# EasyEDA Pro project ProPrj_油液微水_2026-11-05.epro

# Schematic Schematic1

## Sheets
1 P1: Board Name: Board1; Create Date: 2026-10-13; Page Name: P1; Project Name: 油液微水; Schematic Name: Schematic1; Update Date: 2026-10-13; Company: 嘉立创EDA; Page Size: A4; Version: V1.0
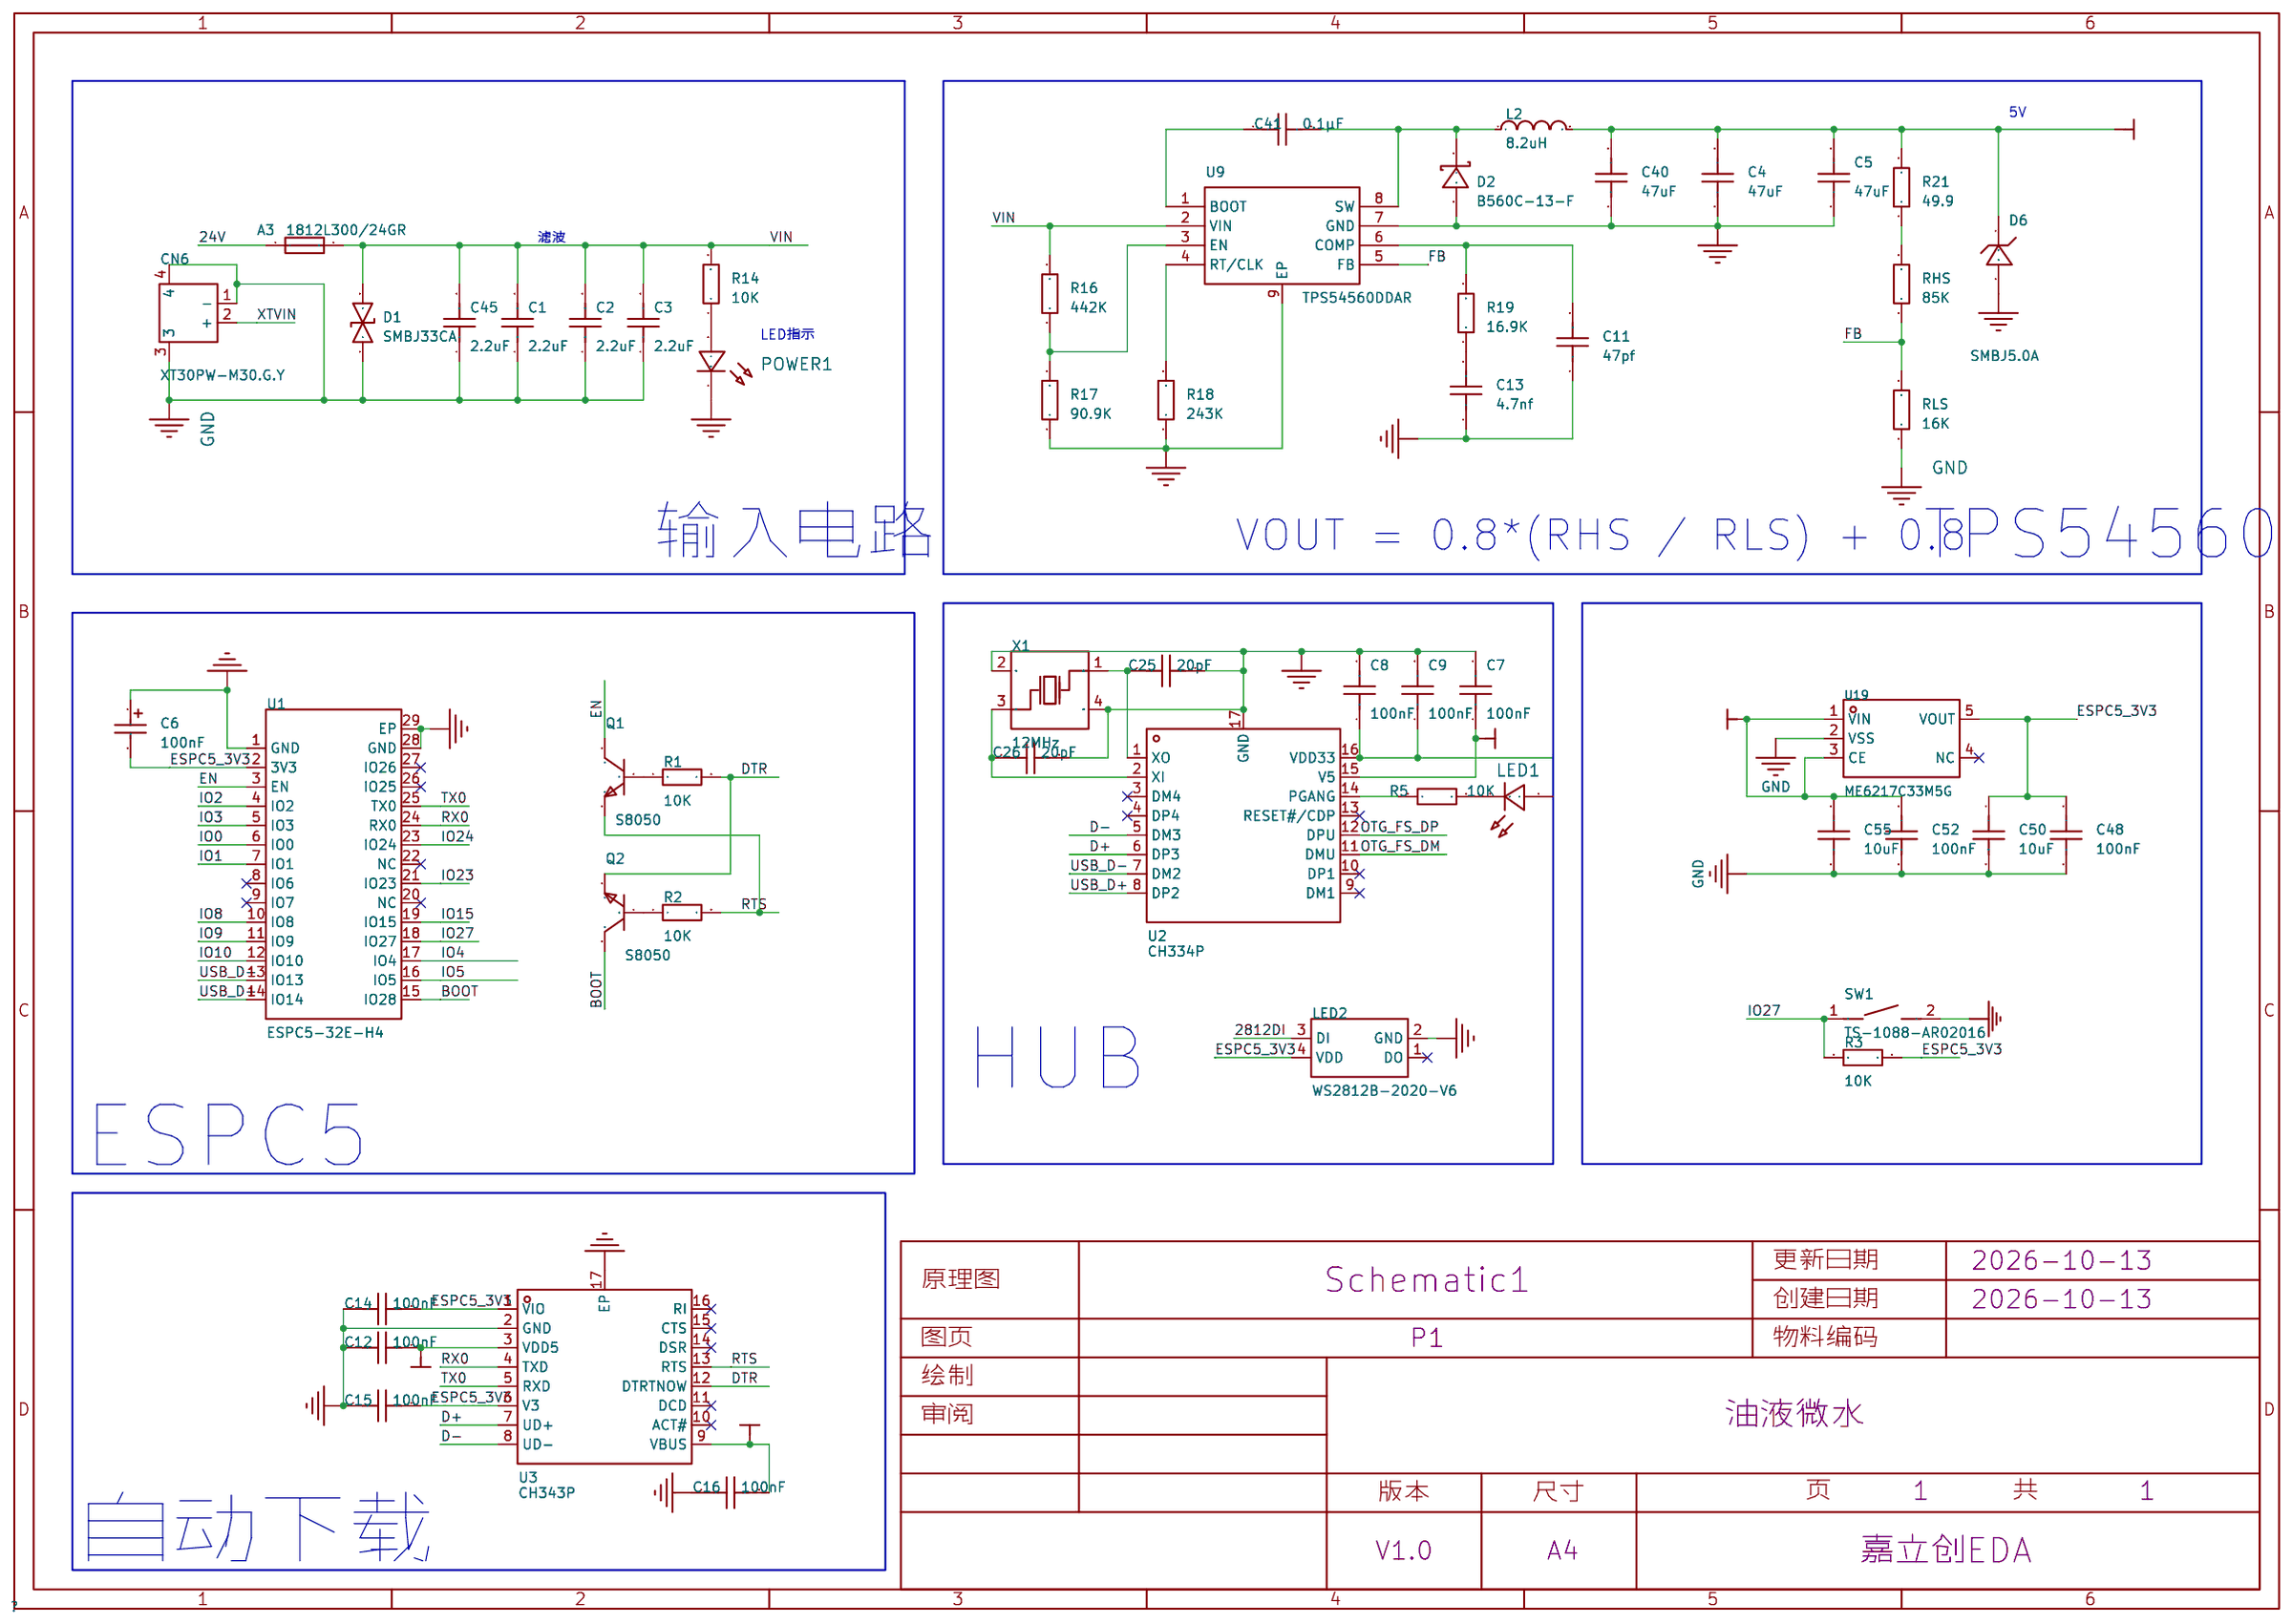
[diagram p0: P1]
2 P2: Page Name: P2
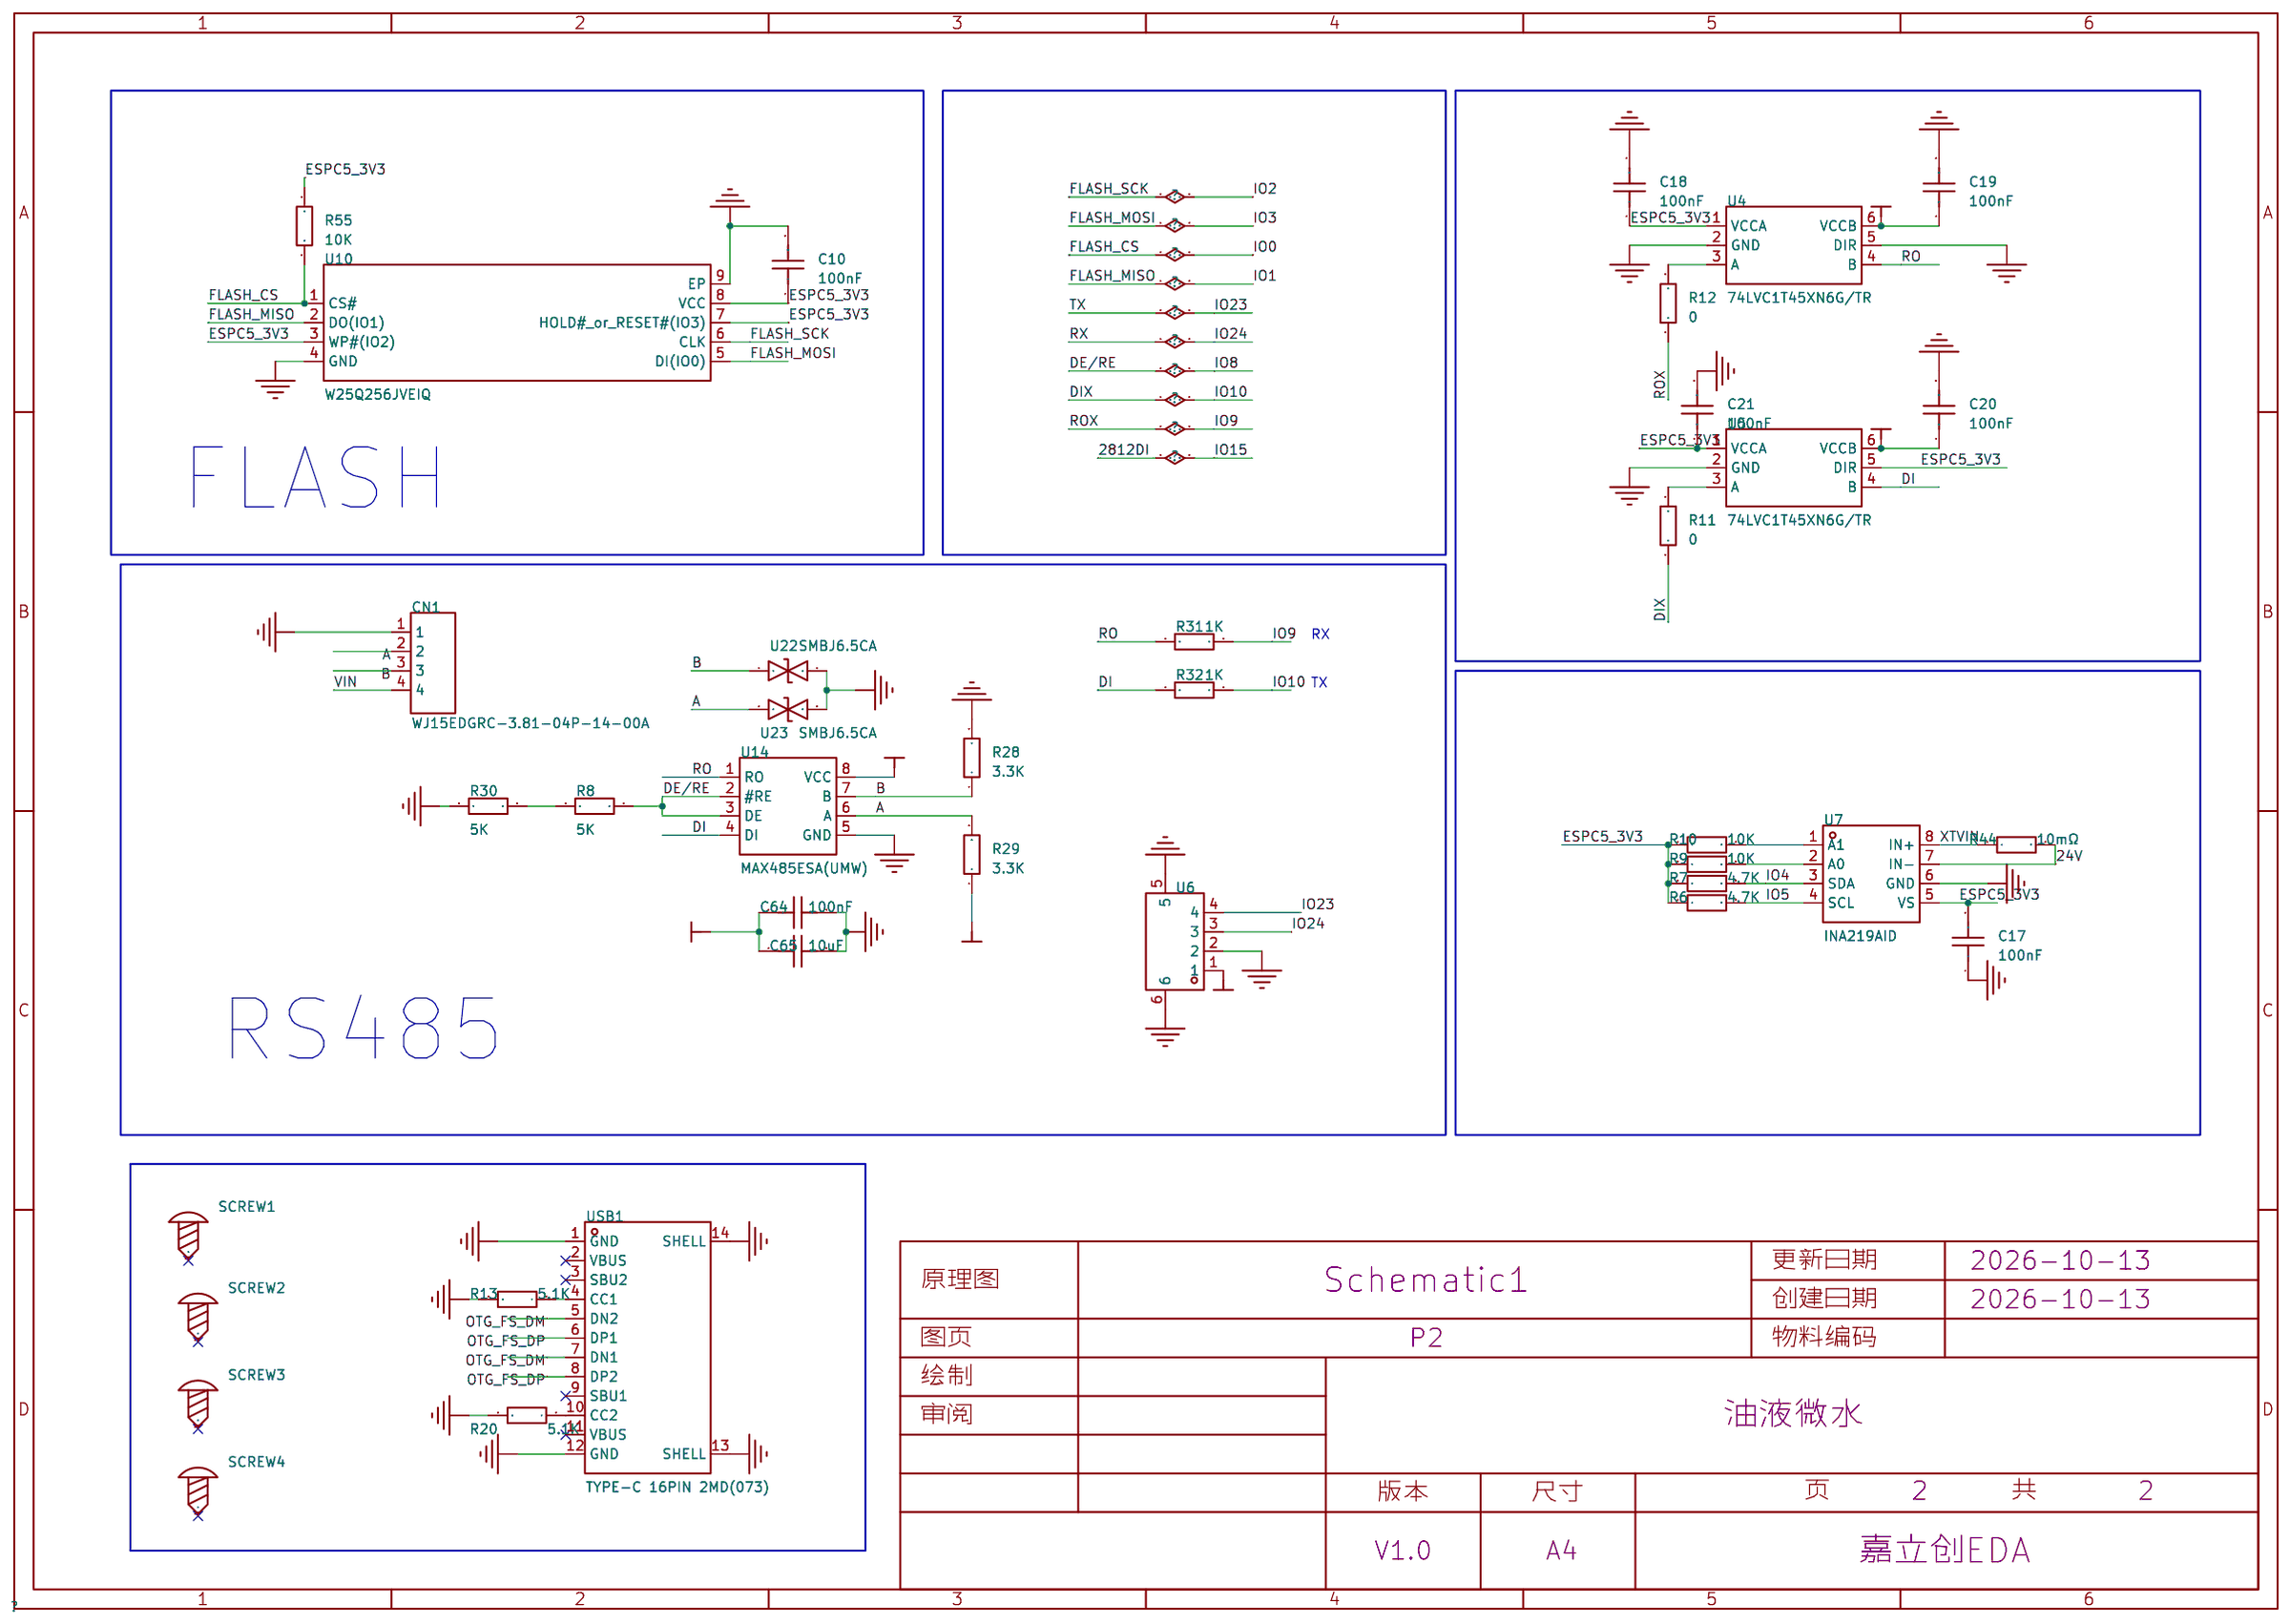
[diagram p1: P2]

## Parts
sheet P1
A3  1812L300/24GR  [F1812]
C1  2.2uF  [C1206]
C2  2.2uF  [C1206]
C3  2.2uF  [C1206]
C4  47uF  [C0805]
C5  47uF  [C0805]
C6  100nF  [CASE-A_3216]
C7  100nF  [C0603]
C8  100nF  [C0603]
C9  100nF  [C0603]
C11  47pf  [C0805]
C12  100nF  [C0603]
C13  4.7nf  [C0805]
C14  100nF  [C0603]
C15  100nF  [C0603]
C16  100nF  [C0603]
C25  20pF  [C0603]
C26  20pF  [C0603]
C40  47uF  [C0805]
C41  0.1µF  [C0805]
C45  2.2uF  [C1206]
C48  100nF  [C0603]
C50  10uF  [C0603]
C52  100nF  [C0603]
C55  10uF  [C0603]
CN6  XT30PW-M30.G.Y  [CONN-TH_XT30PW-M]
D1  SMBJ33CA  [SMB_L4.6-W3.6-LS5.3-BI]
D2  B560C-13-F  [SMC_L7.1-W6.2-LS8.1-RD]
D6  SMBJ5.0A  [SMB_L4.6-W3.6-LS5.3-RD]
L2  8.2uH  [IND-SMD_L11.5-W10.0_FXL1040]
LED1  -  [LED_0603]
LED2  WS2812B-2020-V6  [LED-SMD_4P-L2.2-W2.0-P1.00_WS2815C-2020-4P]
POWER1  -  [LED_0603]
Q1  S8050  [SOT-23-3_L2.9-W1.3-P1.90-LS2.4-BR]
Q2  S8050  [SOT-23-3_L2.9-W1.3-P1.90-LS2.4-BR]
R1  10K  [R0603]
R2  10K  [R0603]
R3  10K  [R0603]
R5  10K  [R0603]
R14  10K  [R0805]
R16  442K  [R0805]
R17  90.9K  [R0805]
R18  243K  [R0805]
R19  16.9K  [R0805]
R21  49.9  [R0805]
RHS  85K  [R0805]
RLS  16K  [R0805]
SW1  TS-1088-AR02016  [SW-SMD_L3.9-W3.0-P4.45]
U1  ESPC5-32E-H4  [WIFIM-SMD_28P-L19.2-W18.0-P1.27-TL_ESPC5-32E-H4]
U2  CH334P  [QFN-16_L3.0-W3.0-P0.50-BL-EP1.7]
U3  CH343P  [TQFN-16_L3.0-W3.0-P0.50-BL-EP1.7]
U9  TPS54560DDAR  [SOIC-8_L5.0-W4.0-P1.27-LS6.0-BL-EP2.0]
U19  ME6217C33M5G  [SOT-23-5_L3.0-W1.7-P0.95-LS2.8-BR]
X1  12MHz  [CRYSTAL-SMD_4P-L3.2-W2.5-BL]
sheet P2
C10  100nF  [C0603]
C17  100nF  [C0603]
C18  100nF  [C0603]
C19  100nF  [C0603]
C20  100nF  [C0603]
C21  100nF  [C0603]
C64  100nF  [C0603]
C65  10uF  [C0603]
CN1  WJ15EDGRC-3.81-04P-14-00A  [CONN-TH_WJ15EDGRC-3.81-4P]
R6  4.7K  [R0603]
R7  4.7K  [R0603]
R8  5K  [R0603]
R9  10K  [R0603]
R10  10K  [R0603]
R11  0  [R0603]
R12  0  [R0603]
R13  5.1K  [R0603]
R20  5.1K  [R0603]
R28  3.3K  [R0603]
R29  3.3K  [R0603]
R30  5K  [R0603]
R31  1K  [R0603]
R32  1K  [R0603]
R44  10mΩ  [R1206]
R55  10K  [R0603]
SCREW1  -  [M3螺丝]
SCREW2  -  [M3螺丝]
SCREW3  -  [M3螺丝]
SCREW4  -  [M3螺丝]
U4  74LVC1T45XN6G/TR  [SOT-23-6_L2.9-W1.6-P0.95-LS2.8-BR]
U5  74LVC1T45XN6G/TR  [SOT-23-6_L2.9-W1.6-P0.95-LS2.8-BR]
U6  WAFER-GH1.25-4PWB  [CONN-SMD_4P-P1.25_XUNPU_WAFER-GH1.25-4PWB]
U7  INA219AID  [SOIC-8_L4.9-W3.9-P1.27-LS6.0-BL]
U10  W25Q256JVEIQ  [WSON-8_L6.0-W8.0-P1.27-BL-EP]
U14  MAX485ESA(UMW)  [SOP-8_L5.0-W4.0-P1.27-LS6.0-BL]
U22  SMBJ6.5CA  [SMB_L4.6-W3.5-LS5.3-BI]
U23  SMBJ6.5CA  [SMB_L4.6-W3.5-LS5.3-BI]
USB1  TYPE-C 16PIN 2MD(073)  [USB-C-SMD_TYPE-C-6PIN-2MD-073_2]

## Library data of the parts
A3 = 1812L300/24GR: 最大电压:24V;最大电流:40A;保持电流:3A;跳闸电流:5A;; Supplier Part: C20627123; Manufacturer: LUTE(陆特); Supplier Footprint: 1812; Datasheet: https://atta.szlcsc.com/upload/public/pdf/source/20240229/289BC9D14A0E804C9E14D6209DA64A38.pdf; Supplier: LCSC; Operating Voltage (Max): 24V; Current Rating (Max): 40A; Hold Current: 3A; Trip Current: 5A; Power Dissipation: 1.4W; Resistance - Initial (Ri) (Min): 10mΩ; Resistance - Post Trip (R1) (Max): 60mΩ; Maximum Time to Trip: 4s; Operating Temperature: -40℃~+85℃
C1-C3 C45 = CAP_1206: Supplier Footprint: 1206
C4 C5 C11 C13 C40 C41 = CAP_0805: Supplier Footprint: 0805
C6 = TAJA104K035RNJ: 容值:100nF;精度:±10%;额定电压:35V;等效串联电阻:24Ω@100kHz;; LCSC Part Name: 100nF ±10% 35V; Supplier Part: C7173; Manufacturer: Kyocera AVX; Supplier Footprint: CASE-A-3216; JLCPCB Part Class: Extended Part; Datasheet: https://atta.szlcsc.com/upload/public/pdf/source/20160107/1457707750344.pdf; Supplier: LCSC; Tolerance: ±10%; Rated Voltage: 35V; Equivalent Series Resistance(ESR): 24Ω@100kHz; Operating Temperature: -55℃~+125℃
C7-C10 C12 C14-C21 C25 C26 C48 C50 C52 C55 C64 C65 = CAP_0603: Supplier Footprint: 0603
CN6 = XT30PW-M30.G.Y: LCSC Part Name: AMASS(艾迈斯)航模插头 卧式弯脚 XT30PW-M公头; Supplier Part: C431092; Manufacturer: AMASS(艾迈斯); JLCPCB Part Class: Extended Part; Datasheet: https://item.szlcsc.com/datasheet/XT30PW-M30.G.Y/426930.html; Supplier: LCSC; Type: 航模插头; RatedVoltage: DC 500V; InterfaceType: 公头; RatedCurrent: 15A; RecommendedWireGauge: 16/18/20AWG; contact resistance: 1.2mΩ; specifications: 2pin
D1 = SMBJ33CA: 反向截止电压(Vrwm):33V;最大钳位电压:53.3V;峰值脉冲电流(Ipp):11.3A;击穿电压:36.7V;; Supplier Part: C143164; Manufacturer: FMS(美丽微); Supplier Footprint: SMB(DO-214AA); JLCPCB Part Class: Extended Part; Datasheet: https://atta.szlcsc.com/upload/public/pdf/source/20191125/C461412_D06D094152DCAA63D23E11D143615915.pdf; Supplier: LCSC; Reverse Stand-Off Voltage (Vrwm): 33V; Maximum Clamping Voltage: 53.3V; Peak Pulse Current (Ipp): 11.3A; Breakdown Voltage: 36.7V; Type: TVS
D2 = B560C-13-F: LCSC Part Name: 电压:60V 电流:5A; Supplier Part: C85100; Manufacturer: DIODES(美台); Supplier Footprint: SMC(DO-214AB); Datasheet: https://atta.szlcsc.com/upload/public/pdf/source/20171023/C134461_15087453602301052556.pdf; Supplier: LCSC; Forward Voltage (Vf@If): 700mV@5A; Reverse Voltage (Vr): 60V; Rectified Current: 5A; Reverse Leakage Current (Ir): 500uA@60V
D6 = SMBJ5.0A_C83333: 极性:单向;反向截止电压(Vrwm):5V;钳位电压:9.2V;峰值脉冲电流(Ipp):65.3A;峰值脉冲功率(Ppp):600W;击穿电压:6.4V;; LCSC Part Name: 单向TVS 5V截止 峰值浪涌电流：65.3A; Supplier Part: C83333; Manufacturer: Littelfuse(美国力特); Supplier Footprint: DO-214AA; Datasheet: https://item.szlcsc.com/datasheet/SMBJ5.0A/84497.html; Supplier: LCSC; Polarity: 单向; Reverse Stand-Off Voltage (Vrwm): 5V; Clamping Voltage: 9.2V; Peak Pulse Current (Ipp): 65.3A; Peak Pulse Power Dissipation (Ppp): 600W; Voltage - Breakdown: 6.4V; Reverse Leakage Current (Ir): 65.3uA; Operating Temperature: -65℃~+150℃; level of protection: IEC 61000-4-4；IEC 61000-4-2; Type: TVS
L2 = MWSA1004S-8R2MT: 电感值:8.2uH;精度:±20%;额定电流:8A;饱和电流(Isat):9A;类型:-;; LCSC Part Name: 8.2uH ±20% 9A; Supplier Part: C408486; Manufacturer: Sunlord(顺络); Supplier Footprint: SMD,11x10mm; JLCPCB Part Class: Extended Part; Datasheet: https://item.szlcsc.com/datasheet/MWSA1004S-8R2MT/397838.html; Supplier: LCSC; Tolerance: ±20%; Current Rating: 8A; Current - Saturation(Isat): 9A; DC Resistance(DCR): 27mΩ
LED1 POWER1 = LED_0603-R: Supplier Footprint: 0603
LED2 = WS2812B-2020-V6: LCSC Part Name: 智能外控集成LED光源，内置信号整形和复位电路，支持单线通讯，颜色一致性好; Supplier Part: C52917434; Manufacturer: worldsemi; Supplier Footprint: SMD2020-4P; JLCPCB Part Class: Extended Part; Datasheet: https://item.szlcsc.com/datasheet/WS2812B-2020-V6/55827425.html; Supplier: LCSC; Dominant Wavelength - R: 620nm~625nm; Dominant Wavelength - G: 515nm~520nm; Dominant Wavelength - B: 465nm~470nm; Data Transmission Rate: 800Kbit/s; Voltage - Supply: 3.3V~5.3V; Quiescent Current: 1uA; Operating Temperature: -40℃~+85℃; Fixed-Frequency Pwm Mode: 2kHz; Length: 2mm; Width: 2mm; Height: 0.84mm; Features: 内置上电复位电路；集成智能反向连接保护功能；内置掉电复位电路; Luminous Intensity - R: 200mcd; Luminous Intensity - G: 520mcd; Luminous Intensity - B: 160mcd; Transmission Delay: 300ns; Fall Time: 120us
Q1 Q2 = S8050_C2688231: 晶体管类型:NPN;集电极电流(Ic):800mA;集射极击穿电压(Vceo):25V;功率(Pd):350mW;直流电流增益(hFE@Ic,Vce):200@50mA,1V;; LCSC Part Name: NPN 电流:800mA 耐压:25V; Supplier Part: C2688231; Manufacturer: WPMtek(维攀); Supplier Footprint: SOT-23; JLCPCB Part Class: 扩展库; Datasheet: https://atta.szlcsc.com/upload/public/pdf/source/20210222/C2688231_A300D69B63960DEEA81943DA6762DFE1.pdf; Supplier: LCSC; Transistor Type: NPN; Collector Current (Ic): 800mA; Collector-Emitter Breakdown Voltage (Vceo): 25V; Power Dissipation (Pd): 350mW; DC Current Gain (hFE@Ic,Vce): 200@50mA,1V; Transition Frequency (fT): 150MHz; Collector Cut-Off Current (Icbo): 100nA; Collector-Emitter Saturation Voltage (VCE(sat)@Ic,Ib): 600mV@500mA,50mA
R1-R3 R5-R13 R20 R28-R32 R55 = Res_0603: Supplier Footprint: 0603
R14 R16-R19 R21 RHS RLS = Res_0805: Supplier Footprint: 0805
SW1 = TS-1088-AR02016: 电路结构:单刀单掷;按钮形状:圆形按钮;作用力:1.6N;安装方式:立贴;开关长度:3.9mm;开关宽度:3mm;开关高度:2mm;带支架:不带支架;触点电流:50mA;额定电压:12V;带灯:-;工作寿命:10万次;; LCSC Part Name: 3.9*3*2mm 立贴 轻触开关; Supplier Part: C720477; Manufacturer: XUNPU(讯普); Supplier Footprint: SMD,4x3mm; JLCPCB Part Class: Basic Part; Datasheet: https://item.szlcsc.com/datasheet/TS-1088-AR02016/763484.html; Supplier: LCSC; Circuit: 单刀单掷; Actuator Style: 圆形按钮; Operating Force: 1.6N; Mounting Type: 立贴; Length: 3.9mm; Width: 3mm; Switch Height: 2mm; with Bracket: 不带支架; Contact Current: 50mA; Voltage Rating: 12V; Actuator/Cap Color: 黑色; Termination Style: SMD接片; Life: 10万次; Operating Temperature: -30℃~+80℃
U1 = ESPC5-32E-H4: WiFi6 2.4&5G Zigbee3+Thread模组,ESP32-C5芯片,32Mbit Flash,IPEX接口模组; LCSC Part Name: ESP32-C5系列，WiFi 2.4G&5G 双频模组，ESPC5-32E-H4，蓝牙模组，ZigBee模组; Supplier Part: C52139915; Manufacturer: DOIT(四博智联); Supplier Footprint: SMD,19.2x18mm; JLCPCB Part Class: Extended Part; Datasheet: https://item.szlcsc.com/datasheet/ESPC5-32E-H4/54934547.html; Supplier: LCSC; Features: 集成蓝牙功能；集成Zigbee功能
U2 = CH334P: CH334和CH335是符合USB2.0协议规范的4端口USBHUB控制器芯片，上行端口支持USB2.0高速和全速，下行端口支持USB2.0高速480Mbps、全速12Mbps和低速1.5Mbps。; LCSC Part Name: 4端口USB HUB控制器芯片，支持USB2.0协议，多模式工作; Supplier Part: C5373042; Manufacturer: WCH(南京沁恒); Supplier Footprint: QFN-16(3x3); JLCPCB Part Class: Extended Part; Datasheet: https://item.szlcsc.com/datasheet/CH334P/6226077.html; Supplier: LCSC; type: 集线器; USB Protocol: USB 2.0; Data Rate: 480Mbps; Voltage - Supply: 3.3V; Operating Temperature: -40℃~+85℃; Memory Interface: I2C; Current - Supply: 85mA; Quiescent Supply Current: 0.4mA; Number of Channels: 4; Features: 端口状态监测；内部稳压器；端口电源开关控制；ESD保护；低功耗模式；上电复位
U3 = CH343P: 应用功能:USB转UART;USB协议版本:USB 2.0;通道数:-;数据速率:6Mbps;; LCSC Part Name: USB转高速串口芯片; Supplier Part: C2846043; Manufacturer: WCH(南京沁恒); Supplier Footprint: TQFN-16-EP(3x3); JLCPCB Part Class: Extended Part; Datasheet: https://item.szlcsc.com/datasheet/CH343P/3039795.html; Supplier: LCSC; Applications Function: USB转UART; USB Protocol: USB 2.0; Voltage - Supply: 3.3V；5V; Data Rate: 6Mbps; Operating Temperature: -40℃~+85℃; Current - Supply: 3mA; Quiescent Supply Current: 90uA; Features: 可编程波特率；唤醒功能；内置时钟发生器；硬件流控支持；低功耗模式；上电复位
U9 = TPS54560DDAR: LCSC Part Name: 4.5V至60V输入,5A降压DC-DC转换器; Supplier Part: C31966; Manufacturer: TI(德州仪器); Supplier Footprint: SOIC-8-EP; Datasheet: https://www.ti.com/cn/lit/gpn/tps54560; Supplier: LCSC; Function: 降压型; Output Type: 可调; Input Voltage: 4.5V~60V; Output Voltage: 800mV~58.8V; Output Current: 5A; Switching Frequency: 2.5MHz; Operating Temperature: -40℃~+150℃@(TJ); Synchronous Rectification: 否; Number of Outputs: 1; Topology: 降压式; Switch tube (built-in/external): 内置
U19 = ME6217C33M5G: 输出类型:固定;输出极性:正;最大输入电压:7V;输出电压:3.3V;输出电流:800mA;电源纹波抑制比(PSRR):65dB@(1kHz);; Supplier Part: C427602; Manufacturer: MICRONE(南京微盟); Supplier Footprint: SOT-23-5; JLCPCB Part Class: 扩展库; Datasheet: https://atta.szlcsc.com/upload/public/pdf/source/20190910/C427602_D4B9162A2E9D9EF57C60010DFDECEF37.pdf; Supplier: LCSC; Output Type: 固定; Output Polarity: 正; Number of Outputs: 1; Maximum Input Voltage: 7V; Output Voltage: 3.3V; Dropout Voltage: 180mV@(300mA); Output Current: 800mA; Power Supply Rejection Ratio (PSRR): 65dB@(1kHz)
X1 = X322512MSB4SI: 晶振类型:贴片晶振;频率:12MHz;常温频差:±10ppm;负载电容:20pF;频率稳定度:±20ppm;; LCSC Part Name: YSX321SL 12MHZ 4P 3225 20PF ±10PPM -40~85℃ (±20PPM); Supplier Part: C9002; Manufacturer: YXC(扬兴晶振); Supplier Footprint: SMD3225-4P; JLCPCB Part Class: Basic Part; Datasheet: https://item.szlcsc.com/datasheet/X322512MSB4SI/9522.html; Supplier: LCSC; Type: 贴片晶振; Normal temperature Frequency Tolerance: ±10ppm; Load Capacitance: 20pF; Frequency Stability: ±20ppm; Equivalent Series Resistance(ESR): 80Ω; Operating Temperature: -40℃~+85℃
CN1 = WJ15EDGRC-3.81-04P-14-00A: 连接器类型:板端/插座-闭口;固定方式:无固定装置;结构:1x4P;间距:3.81mm;颜色:绿色;安装方式:弯插;排数:1;每排PIN数:4;额定电流:8A;额定电压:300V;线规 - AWG:-;线规 - 平方毫米:-;工作温度:-40℃~+105℃;; LCSC Part Name: 无固定装置 1x4P 3.81mm 排数:1 每排P数:4; Supplier Part: C7245; Manufacturer: KANGNEX(康奈克斯电气); Supplier Footprint: 弯插,P=3.81mm; JLCPCB Part Class: Extended Part; Datasheet: https://item.szlcsc.com/datasheet/WJ15EDGRC-3.81-04P-14-00A/7720.html; Supplier: LCSC; Connector Type: 板端/插座-闭口; Termination Style: 无固定装置; Number of Positions or Pins: 1x4P; Pitch: 3.81mm; Color: 绿色; Mounting Type: 弯插; Number of Pins: 4P; Number of Rows: 1; Number of PINs Per Row: 4; Current Rating: 8A; Voltage Rating (Max): 300V; Operating Temperature: -40℃~+105℃
R44 = RLM12FTCMR010: 电阻类型:采样电阻;阻值:10mΩ;精度:±1%;功率:1W;温度系数:±100ppm/℃;安装方式:贴片;; LCSC Part Name: 10mΩ ±1% 1W 合金电阻; Supplier Part: C188070; Manufacturer: 大毅科技; Supplier Footprint: 1206; JLCPCB Part Class: Extended Part; Datasheet: https://item.szlcsc.com/datasheet/RLM12FTCMR010/199476.html; Supplier: LCSC; Type: 采样电阻; Tolerance: ±1%; Power(Watts): 1W; Temperature Coefficient: ±100ppm/℃; Mounting Type: 贴片
SCREW1-SCREW4 = M3螺丝: Supplier Footprint: 插件
U4 U5 = 74LVC1T45XN6G/TR: 输入类型:-;工作电压:1.65V~5.5V;元件数:1;每个元件位数:1;灌电流(IOL):32mA;拉电流(IOH):32mA;; Supplier Part: C5153337; Manufacturer: SGMICRO(圣邦微); Supplier Footprint: SOT-23-6; JLCPCB Part Class: Extended Part; Datasheet: https://item.szlcsc.com/datasheet/74LVC1T45XN6G%252FTR/5780065.html; Supplier: LCSC; output type: 三态; Voltage - Supply: 1.65V~5.5V; Number of Elements: 1; Number of Bits per Element: 1; Channel Type: 双向; Current - Output Low(IOL): 32mA; Current - Output High(IOH): 32mA; Logic Family: 74LVC; Operating Temperature: -40℃~+125℃; Quiescent Current: 2uA; Propagation Delay: 2.5ns@5V,15pF; Features: 掉电隔离；电平转换
U6 = WAFER-GH1.25-4PWB: 插针结构:1x4P;间距:1.25mm;安装方式:卧贴;参考系列:GH;总PIN数:4P;排数:1;每排PIN数:4;行距:-;额定电流:1A;触头材质:黄铜;触头镀层:-;工作温度范围:-25℃~+85℃;; LCSC Part Name: 1x4P 间距:1.25mm 卧贴 系列:GH; Supplier Part: C3029379; Manufacturer: XUNPU(讯普); Supplier Footprint: SMD,P=1.25mm,卧贴; JLCPCB Part Class: Extended Part; Datasheet: https://atta.szlcsc.com/upload/public/pdf/source/20220527/CB8773BFB0913C3B8ABD62CB38BA101A.pdf; Supplier: LCSC; Pins Structure: 1x4P; Pitch: 1.25mm; Mounting Type: 卧贴; Reference Series: GH; Number of Pins: 4P; Number of Rows: 1; Number of PINs Per Row: 4; Current Rating: 1A; Contact Material: 黄铜; Operating Temperature: -25℃~+85℃; Voltage Rating: 125V; Plastic Material: LCP; Supplementary Features: 辅助焊脚; Color: 米色; Z-Height of the Board: 4.35mm; X-Length of Bottom Edge on Board (Spacing Line): 8.25mm; Y-Width of Bottom Edge on Board: 5mm
U7 = INA219AID: 放大器数:1;共模电压:300mV~26V;增益:-;带宽(-3db):-;; LCSC Part Name: 具有I2C接口的零漂移双向电流/功率监测计 停产; Supplier Part: C1574856; Manufacturer: TI(德州仪器); Supplier Footprint: SOIC-8; JLCPCB Part Class: Extended Part; Datasheet: https://www.ti.com/cn/lit/ds/symlink/ina219.pdf; Supplier: LCSC; Number of Channels: 1; Vcm - Common Mode Voltage: 300mV~26V; Ib - Input Bias Current: 20uA; Vos - Input Offset Voltage: 10uV; Operating Temperature: -40℃~+125℃; Differential Voltage: ±26V; Single Supply: 3V~5.5V; Quiescent Current: 700uA; Input Offset Voltage Drift(Vos TC): 0.1uV/℃; Common Mode Rejection Ratio (CMRR): 120dB; Features: 双向检测；输入滤波器；数字输出接口；功率监控；零漂移/自动稳零
U10 = W25Q256JVEIQ: 接口类型:SPI;存储容量:256Mbit;时钟频率(fc):133MHz;; LCSC Part Name: 具备双/四SPI接口的3V、256Mbit 串行闪存; Supplier Part: C2682312; Manufacturer: Winbond(华邦); Supplier Footprint: WSON-8-EP(6x8); JLCPCB Part Class: Extended Part; Datasheet: https://item.szlcsc.com/datasheet/W25Q256JVEIQ/2776751.html; Supplier: LCSC; Interface: SPI; Memory Size: 256Mbit; Clock Frequency: 133MHz; Voltage - Supply: 2.7V~3.6V; Standby Supply Current: 10uA; Program / Erase Cycles: 100000次; Page Programming Time (Tpp): 700us; Block Erase Time(tBE): 100ms@(64KB); Data Retention - TDR (Year): 20年; Operating Temperature: -40℃~+85℃; Features: 硬件写保护；绝对写保护；写使能锁存；软件写保护；上电复位；电源锁定保护
U14 = MAX485ESA(UMW): 类型:收发器;数据速率:2.5Mbps;; LCSC Part Name: 低功耗、压摆率受限的RS-485/RS-422收发器; Supplier Part: C668206; Manufacturer: UMW(友台半导体); Supplier Footprint: SOP-8; JLCPCB Part Class: Extended Part; Datasheet: https://item.szlcsc.com/datasheet/MAX485ESA(UMW)/698054.html; Supplier: LCSC; Type: 收发器; Number of Drivers: 1; Number of Receivers: 1; Voltage - Supply: 5V; Data Rate: 2.5Mbps; Number of Nodes: 32; Supply Current (Iq): 300uA; Communication Mode: 半双工
U22 U23 = SMBJ6.5CA_C7420377: 极性:双向;反向截止电压(Vrwm):6.5V;钳位电压:11.2V;峰值脉冲电流(Ipp):53.57A;峰值脉冲功率(Ppp):600W;击穿电压:7.22V;; LCSC Part Name: 双向TVS 6.5V截止 峰值浪涌电流：53.57A; Supplier Part: C7420377; Manufacturer: R+O(宏嘉诚); Supplier Footprint: DO-214AA(SMB); JLCPCB Part Class: Basic Part; Datasheet: https://item.szlcsc.com/datasheet/SMBJ6.5CA/8397199.html; Supplier: LCSC; Polarity: 双向; Reverse Stand-Off Voltage (Vrwm): 6.5V; Clamping Voltage: 11.2V; Peak Pulse Current (Ipp): 53.57A; Peak Pulse Power Dissipation (Ppp): 600W; Voltage - Breakdown: 7.22V; Reverse Leakage Current (Ir): 500uA; Number of Channels: 单路; Operating Temperature: -55℃~+150℃; level of protection: IEC 61000-4-2; Type: TVS
USB1 = TYPE-C 16PIN 2MD(073)_2: LCSC Part Name: Type-C 母 卧贴; Supplier Part: C2765186; Manufacturer: SHOU HAN(首韩); Supplier Footprint: SMD; JLCPCB Part Class: 扩展库; Datasheet: https://atta.szlcsc.com/upload/public/pdf/source/20211123/39B17C16241EAC15C5E277BDA434118E.pdf; Supplier: LCSC; Connector Type: Type-C; Gender: 母; Number of Ports: 1; Number of Contacts: 16P; Mounting Style: 卧贴; Current Rating - Power (Max): 5A; Operating Temperature Range: -25℃~+85℃

## Nets
24V: A3.1 R44.2 U7.7(IN-)
+5V: C4.2 C5.2 C7.1 C12.2 C16.2 C19.1 C20.1 C40.2 C52.1 C55.1 C64.1 C65.1 D6.1 L2.2 R21.2 R29.1 U2.15(V5) U3.3(VDD5) U3.9(VBUS) U4.6(VCCB) U5.6(VCCB) U6.1 U14.8(VCC) U19.1(VIN) U19.3(CE)
GND: C1.1 C2.1 C3.1 C4.1 C5.1 C6.1 C7.2 C8.2 C9.2 C10.2 C11.1 C12.1 C13.1 C14.1 C15.1 C16.1 C17.1 C18.2 C19.2 C20.2 C21.2 C25.2 C26.2 C40.1 C45.1 C48.2 C50.2 C52.2 C55.2 C64.2 C65.2 CN1.1 CN6.1(-) CN6.3 CN6.4 D1.1 D2.2(A) D6.2 LED2.2(GND) POWER1.1(C) R13.2 R17.1 R18.1 R20.2 R28.2 R30.2 RLS.1 SW1.2 U1.1(GND) U1.28(GND) U1.29(EP) U2.17(GND) U3.2(GND) U3.17(EP) U4.2(GND) U4.5(DIR) U5.2(GND) U6.2 U6.5 U6.6 U7.6(GND) U9.7(GND) U9.9(EP) U10.4(GND) U10.9(EP) U14.5(GND) U19.2(VSS) U22.2 U23.2 USB1.1(GND) USB1.12(GND) USB1.13(SHELL) USB1.14(SHELL) X1.2(GND) X1.4(GND)
VIN: A3.2 C1.2 C2.2 C3.2 C45.2 CN1.4 D1.2 R14.2 R16.2 U9.2(VIN)
2812DI: LED2.3(DI) U1.19(IO15)
A: CN1.2 R29.2 U14.6(A) U23.1
B: CN1.3 R28.1 U14.7(B) U22.1
BOOT: Q2.3(C) U1.15(IO28)
D+: U2.6(DP3) U3.7(UD+)
D-: U2.5(DM3) U3.8(UD-)
DE/RE: R8.1 U1.10(IO8) U14.2(#RE) U14.3(DE)
DI: R32.1 U5.4(B) U14.4(DI)
DIX: R11.1 R32.2 U1.12(IO10)
DTR: Q2.2(E) R1.2 U3.12(DTRTNOW)
EN: Q1.3(C) U1.3(EN)
ESPC5_3V3: C6.2 C10.1 C14.2 C15.2 C17.2 C18.1 C21.1 C48.1 C50.1 LED2.4(VDD) R3.2 R6.1 R7.1 R9.1 R10.1 R55.2 U1.2(3V3) U3.1(VIO) U3.6(V3) U4.1(VCCA) U5.1(VCCA) U5.5(DIR) U7.5(VS) U10.3(WP#(IO2)) U10.7(HOLD# or RESET#(IO3)) U10.8(VCC) U19.5(VOUT)
FB: RHS.1 RLS.2 U9.5(FB)
FLASH_CS: R55.1 U1.6(IO0) U10.1(CS#)
FLASH_MISO: U1.7(IO1) U10.2(DO(IO1))
FLASH_MOSI: U1.5(IO3) U10.5(DI(IO0))
FLASH_SCK: U1.4(IO2) U10.6(CLK)
IO4: R7.2 U1.17(IO4) U7.3(SDA)
IO5: R6.2 U1.16(IO5) U7.4(SCL)
IO9: R12.1 R31.2 U1.11(IO9)
IO23: U1.21(IO23) U6.4
IO24: U1.23(IO24) U6.3
IO27: R3.1 SW1.1 U1.18(IO27)
OTG_FS_DM: U2.11(DMU) USB1.5(DN2) USB1.7(DN1)
OTG_FS_DP: U2.12(DPU) USB1.6(DP1) USB1.8(DP2)
RO: R31.1 U4.4(B) U14.1(RO)
RTS: Q1.2(E) R2.2 U3.13(RTS)
RX0: U1.24(RX0) U3.4(TXD)
TX0: U1.25(TX0) U3.5(RXD)
USB_D+: U1.14(IO14) U2.8(DP2)
USB_D-: U1.13(IO13) U2.7(DM2)
XTVIN: CN6.2(+) R44.1 U7.8(IN+)
$1N2: R16.1 R17.2 U9.3(EN)
$1N4: R18.2 U9.4(RT/CLK)
$1N11: C11.2 R19.2 U9.6(COMP)
$1N12: C41.2 D2.1(K) L2.1 U9.8(SW)
$1N13: C13.2 R19.1
$1N17: C41.1 U9.1(BOOT)
$1N21: POWER1.2(A) R14.1
$1N24: R21.1 RHS.2
$1N35: Q1.1(B) R1.1
$1N36: Q2.1(B) R2.1
$1N60: C26.1 U2.2(XI) X1.3(OSC2)
$1N61: C25.1 U2.1(XO) X1.1(OSC1)
$1N64: C8.1 C9.1 LED1.2(A) U2.16(VDD33)
$1N65: LED1.1(C) R5.2
$1N66: R5.1 U2.14(PGANG)
$2N19: R8.2 R30.1
$2N64: R11.2 U5.3(A)
$2N65: R12.2 U4.3(A)
$2N83: R20.1 USB1.10(CC2)
$2N90: R13.1 USB1.4(CC1)
$2N111: R9.2 U7.2(A0)
$2N112: R10.2 U7.1(A1)

Not connected (* = marked no-connect by the designer): LED2 1(DO)*; SCREW1 1*; SCREW2 1*; SCREW3 1*; SCREW4 1*; U1 8(IO6)* 9(IO7)* 20(NC)* 22(NC)* 26(IO25)* 27(IO26)*; U2 3(DM4)* 4(DP4)* 9(DM1)* 10(DP1)* 13(RESET#/CDP)*; U3 10(ACT#)* 11(DCD)* 14(DSR)* 15(CTS)* 16(RI)*; U19 4(NC)*; USB1 2(VBUS)* 3(SBU2)* 9(SBU1)* 11(VBUS)*

## Notes on the sheets
sheet 1
- 5V
- 滤波
- LED指示
- 输入电路
- VOUT = 0.8*(RHS / RLS) + 0.8
- TPS54560
- HUB
- ESPC5
- 自动下载
sheet 2
- FLASH
- RX
- TX
- RS485

# Board PCB1
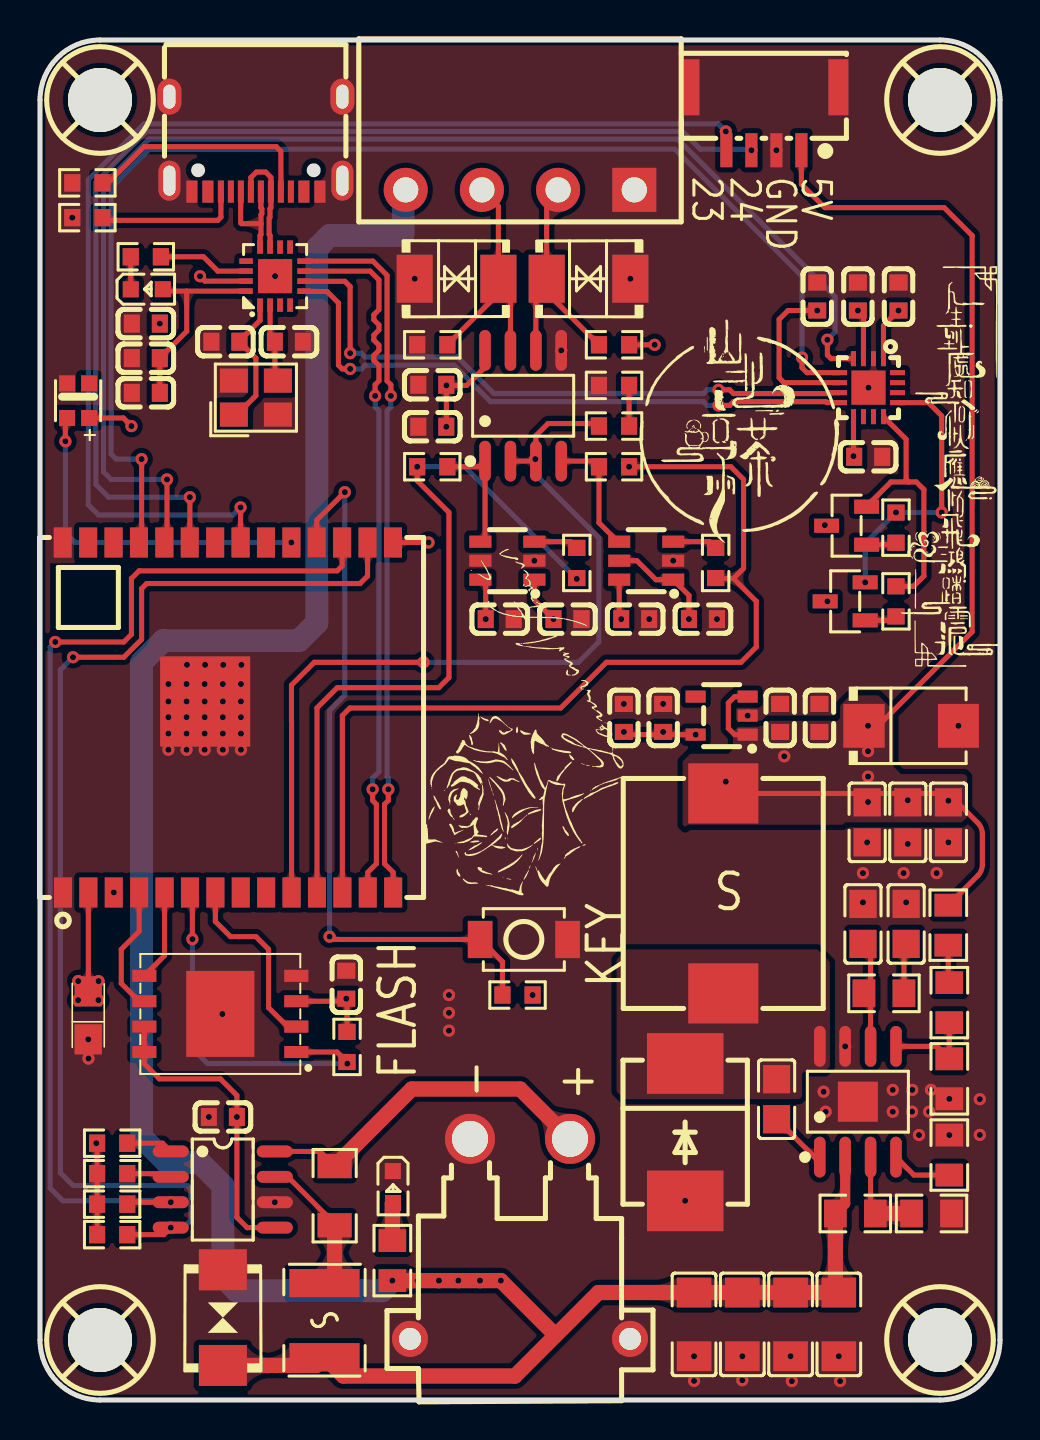
[diagram p2: board, top side]
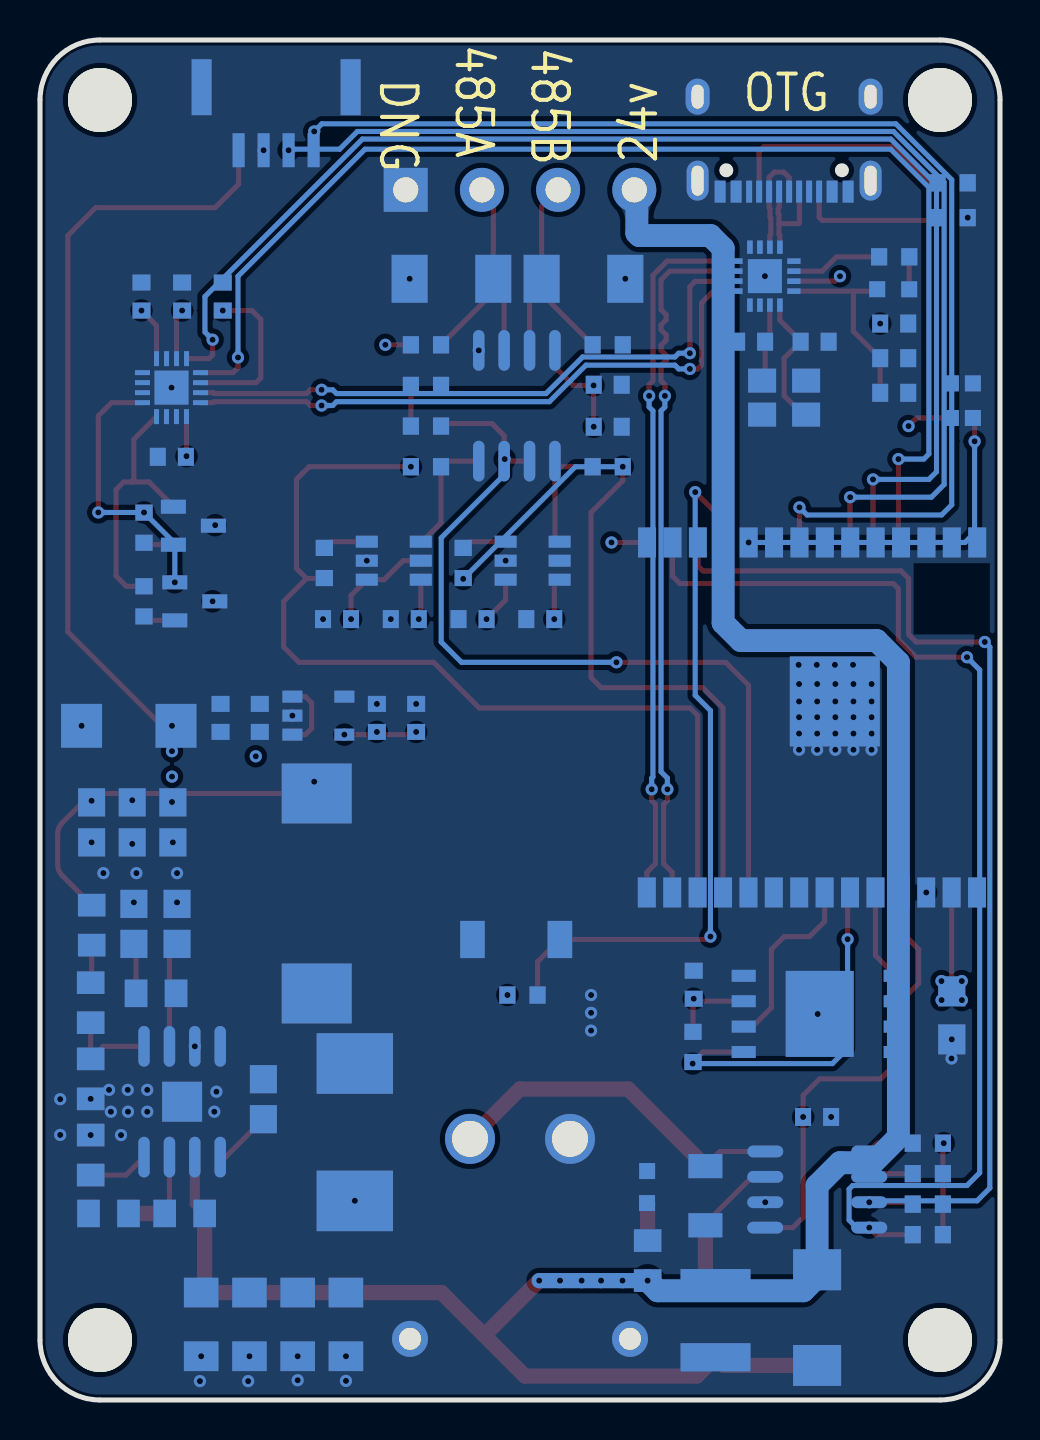
[diagram p3: board, bottom side, seen from below]

Outline 48 x 68 mm; copper layers: Top Layer, Inner1, Inner2, Bottom Layer. Coordinates in mm from the lower left corner of the outline.
Outline path: 0,65 0,3 arc(0.88,0.88) 3,0 45,0 arc(47.12,0.88) 48,3 48,65 arc(47.12,67.12) 45,68 3,68 arc(0.88,67.12) 0,65
Stack: Top Layer 0.035mm Outer layer thickness 1oz / Dielectric1 0.2104mm 7628 RC49% 8.6mil / Inner1 0.0152mm Inner layer thickness / Dielectric2 1.065mm 1.1mm H/HOZ Copper / Inner2 0.0152mm Inner layer thickness / Dielectric3 0.2104mm 7628 RC49% 8.6mil / Bottom Layer 0.035mm Outer layer thickness 1oz

## Design rules (mm)
net A: DP1
net B: DP1
net USB_D-: DP4
net USB_D+: DP4
net D-: DP5
net D+: DP5
net OTG_FS_DM: DP2
net OTG_FS_DP: DP2
spacing copperThickness1oz (default): track to track 0.102, other pairs 0.152 to 0.3
spacing copperThickness2oz: track to track 0.203, other pairs 0.152 to 0.3
track width copperThickness1oz (default): min 0.127, default 0.254, max 2.54
track width copperThickness2oz: min 0.203, default 0.254, max 2.54
differential pair differentialPair (default): width min 0.127, default 0.254, max 2.54; gap min 0.152, default 0.152
net $1N12 uses copperRegion
net GND uses copperRegion
net +5V uses copperRegion
net ESPC5_3V3 uses copperRegion

## Placement (name value [footprint] x y rotation side)
A3  1812L300/24GR  [F1812]  14.22 3.99 270 top
C1  2.2uF  [C1206]  37.53 3.78 90 top
C2  2.2uF  [C1206]  35.12 3.78 90 top
C3  2.2uF  [C1206]  32.7 3.78 90 top
C4  47uF  [C0805]  43.39 28.88 90 top
C5  47uF  [C0805]  45.42 28.88 90 top
C6  100nF  [CASE-A_3216]  2.41 19.23 90 top
C7  100nF  [C0603]  5.29 53.82 180 top
C8  100nF  [C0603]  5.29 52.09 180 top
C9  100nF  [C0603]  5.29 50.36 180 top
C10  100nF  [C0603]  15.31 20.76 90 top
C11  47pf  [C0805]  41.15 23.8 270 top
C12  100nF  [C0603]  40.89 55.17 270 top
C13  4.7nf  [C0805]  43.31 23.8 270 top
C14  100nF  [C0603]  38.86 55.17 270 top
C15  100nF  [C0603]  42.93 55.17 270 top
C16  100nF  [C0603]  41.41 47.16 180 top
C17  100nF  [C0603]  9.14 14.15 0 top
C18  100nF  [C0603]  26.37 39.04 0 top
C19  100nF  [C0603]  22.99 39.04 0 top
C20  100nF  [C0603]  29.76 39.04 0 top
C21  100nF  [C0603]  33.15 39.04 0 top
C25  20pF  [C0603]  9.27 52.91 180 top
C26  20pF  [C0603]  12.45 52.91 0 top
C40  47uF  [C0805]  41.36 28.88 90 top
C41  0.1µF  [C0805]  36.83 15.04 90 top
C45  2.2uF  [C1206]  39.94 3.78 90 top
C48  100nF  [C0603]  29.19 34.1 90 top
C50  10uF  [C0603]  31.16 34.1 90 top
C52  100nF  [C0603]  37.01 34.1 90 top
C55  10uF  [C0603]  38.97 34.1 90 top
C64  100nF  [C0603]  19.61 50.76 180 top
C65  10uF  [C0603]  19.61 48.66 180 top
CN1  WJ15EDGRC-3.81-04P-14-00A  [CONN-TH_WJ15EDGRC-3.81-4P]  24 60.51 180 top
CN6  XT30PW-M30.G.Y  [CONN-TH_XT30PW-M]  24 8.06 0 top
D1  SMBJ33CA  [SMB_L4.6-W3.6-LS5.3-BI]  9.14 4.12 270 top
D2  B560C-13-F  [SMC_L7.1-W6.2-LS8.1-RD]  32.26 13.39 270 top
D6  SMBJ5.0A  [SMB_L4.6-W3.6-LS5.3-RD]  43.56 33.71 0 top
L2  8.2uH  [IND-SMD_L11.5-W10.0_FXL1040]  34.16 25.33 90 top
LED1  -  [LED_0603]  5.39 55.54 0 top
LED2  WS2812B-2020-V6  [LED-SMD_4P-L2.2-W2.0-P1.00_WS2815C-2020-4P]  1.91 49.97 270 top
POWER1  -  [LED_0603]  17.65 10.6 270 top
Q1  S8050  [SOT-23-3_L2.9-W1.3-P1.90-LS2.4-BR]  40.26 39.93 0 top
Q2  S8050  [SOT-23-3_L2.9-W1.3-P1.90-LS2.4-BR]  40.33 43.72 0 top
R1  10K  [R0603]  42.8 39.93 90 top
R2  10K  [R0603]  42.8 43.62 90 top
R3  10K  [R0603]  23.88 20.25 0 top
R5  10K  [R0603]  5.29 57.16 180 top
R6  4.7K  [R0603]  3.61 8.27 0 top
R7  4.7K  [R0603]  3.61 9.79 0 top
R8  5K  [R0603]  28.7 48.7 0 top
R9  10K  [R0603]  3.61 11.32 0 top
R10  10K  [R0603]  3.61 12.84 0 top
R11  0  [R0603]  33.78 41.85 90 top
R12  0  [R0603]  26.84 41.85 90 top
R13  5.1K  [R0603]  2.37 60.86 180 top
R14  10K  [R0805]  17.62 6.97 270 top
R16  442K  [R0805]  40.77 9.33 180 top
R17  90.9K  [R0805]  44.58 9.33 180 top
R18  243K  [R0805]  45.47 12.25 270 top
R19  16.9K  [R0805]  42.2 20.33 180 top
R20  5.1K  [R0603]  2.37 59.12 180 top
R21  49.9  [R0805]  45.41 23.74 90 top
R28  3.3K  [R0603]  19.61 52.76 180 top
R29  3.3K  [R0603]  28.7 52.76 180 top
R30  5K  [R0603]  28.7 50.73 180 top
R31  1K  [R0603]  19.61 46.66 180 top
R32  1K  [R0603]  28.7 46.66 0 top
R44  10mΩ  [R1206]  14.73 10.22 270 top
R55  10K  [R0603]  15.35 17.65 90 top
RHS  85K  [R0805]  45.47 19.87 90 top
RLS  16K  [R0805]  45.47 16.06 90 top
SCREW1  -  [M3螺丝]  3 65 0 top
SCREW2  -  [M3螺丝]  45 65 0 top
SCREW3  -  [M3螺丝]  3 3 0 top
SCREW4  -  [M3螺丝]  45 3 0 top
SW1  TS-1088-AR02016  [SW-SMD_L3.9-W3.0-P4.45]  24.19 23.03 0 top
U1  ESPC5-32E-H4  [WIFIM-SMD_28P-L19.2-W18.0-P1.27-TL_ESPC5-32E-H4]  9.4 34.13 90 top
U2  CH334P  [QFN-16_L3.0-W3.0-P0.50-BL-EP1.7]  11.75 56.19 0 top
U3  CH343P  [TQFN-16_L3.0-W3.0-P0.50-BL-EP1.7]  41.43 50.62 180 top
U4  74LVC1T45XN6G/TR  [SOT-23-6_L2.9-W1.6-P0.95-LS2.8-BR]  23.37 41.97 0 top
U5  74LVC1T45XN6G/TR  [SOT-23-6_L2.9-W1.6-P0.95-LS2.8-BR]  30.31 41.97 0 top
U6  WAFER-GH1.25-4PWB  [CONN-SMD_4P-P1.25_XUNPU_WAFER-GH1.25-4PWB]  36.19 64.06 180 top
U7  INA219AID  [SOIC-8_L4.9-W3.9-P1.27-LS6.0-BL]  9.14 10.52 270 top
U9  TPS54560DDAR  [SOIC-8_L5.0-W4.0-P1.27-LS6.0-BL-EP2.0]  40.89 14.91 0 top
U10  W25Q256JVEIQ  [WSON-8_L6.0-W8.0-P1.27-BL-EP]  9.02 19.3 90 top
U14  MAX485ESA(UMW)  [SOP-8_L5.0-W4.0-P1.27-LS6.0-BL]  24.16 49.71 0 top
U19  ME6217C33M5G  [SOT-23-5_L3.0-W1.7-P0.95-LS2.8-BR]  34.08 34.22 0 top
U22  SMBJ6.5CA  [SMB_L4.6-W3.5-LS5.3-BI]  20.83 56.06 180 top
U23  SMBJ6.5CA  [SMB_L4.6-W3.5-LS5.3-BI]  27.43 56.06 0 top
USB1  TYPE-C 16PIN 2MD(073)  [USB-C-SMD_TYPE-C-6PIN-2MD-073_2]  10.79 62.79 180 top
X1  12MHz  [CRYSTAL-SMD_4P-L3.2-W2.5-BL]  10.79 50.12 0 top

## Footprints (pads in the part's own frame, mm; a bottom-side part is the same pattern mirrored in y, then rotated)
C0603
  rect 0.8x0.9 hole 0.001: 1(-0.7,0) 2(0.7,0)
C0805
  rect 1.41x1.35 hole 0.001: 1(-1,0) 2(1,0)
C1206
  rect 1.485x1.728 hole 0.001: 1(-1.593,0) 2(1.593,0)
CASE-A_3216
  rect 1.5x1.359 hole 0.001: 1(-1.2,0) 2(1.2,0)
CONN-SMD_4P-P1.25_XUNPU_WAFER-GH1.25-4PWB
  rect 0.6x1.7 hole 0.001: 1(-1.875,1.575) 2(-0.625,1.575) 3(0.625,1.575) 4(1.875,1.575)
  rect 1x2.8 hole 0.001: 5(3.725,-1.575) 6(-3.725,-1.575)
CONN-TH_WJ15EDGRC-3.81-4P
  rect 2.2x2.2 hole 1.26: 1(-5.715,0)
  round 2.2 hole 1.26: 2(-1.905,0) 3(1.905,0) 4(5.715,0)
CONN-TH_XT30PW-M
  round 2.5 hole 1.8: 1(-2.5,5) 2(2.5,5)
  round 1.8 hole 1.1: 3(5.5,-5) 4(-5.5,-5)
CRYSTAL-SMD_4P-L3.2-W2.5-BL
  rect 1.4x1.2 hole 0.001: 1(-1.1,-0.85) 2(1.1,-0.85) 3(1.1,0.85) 4(-1.1,0.85)
F1812
  rect 1.407x3.499 hole 0.001: 1(-1.853,0) 2(1.853,0)
IND-SMD_L11.5-W10.0_FXL1040
  rect 3x3.5 hole 0.001: 1(-5,0) 2(5,0)
LED-SMD_4P-L2.2-W2.0-P1.00_WS2815C-2020-4P
  rect 0.8x0.8 hole 0.001: 1(-0.865,0.55) 2(-0.865,-0.55) 3(0.865,-0.55) 4(0.865,0.55)
LED_0603
  rect 0.8x0.8 hole 0.001: 1(-0.851,-0.01) 2(0.75,-0.005)
M3螺丝
  round 3.2 hole 3.2: 1(0,0)
QFN-16_L3.0-W3.0-P0.50-BL-EP1.7
  rect 0.28x0.665 hole 0.001: 1(-0.75,-1.45) 2(-0.25,-1.45) 3(0.25,-1.45) 4(0.75,-1.45) 9(0.75,1.45) 10(0.25,1.45) 11(-0.25,1.45) 12(-0.75,1.45)
  rect 0.665x0.28 hole 0.001: 5(1.45,-0.75) 6(1.45,-0.25) 7(1.45,0.25) 8(1.45,0.75) 13(-1.45,0.75) 14(-1.45,0.25) 15(-1.45,-0.25) 16(-1.45,-0.75)
  rect 1.7x1.7 hole 0.001: 17(0,0)
R0603
  rect 0.806x0.864 hole 0.001: 1(-0.753,0) 2(0.753,0)
R0805
  rect 1.133x1.377 hole 0.001: 1(-1,0) 2(1,0)
R1206
  rect 1.208x1.701 hole 0.001: 1(-1.479,0) 2(1.479,0)
SMB_L4.6-W3.5-LS5.3-BI
  rect 1.8x2.4 hole 0.001: 1(-2.091,0) 2(2.091,0)
SMB_L4.6-W3.6-LS5.3-BI
  rect 2.047x2.4 hole 0.001: 1(-2.391,0) 2(2.391,0)
SMB_L4.6-W3.6-LS5.3-RD
  rect 2.047x2.192 hole 0.001: 1(-2.361,0) 2(2.361,0)
SMC_L7.1-W6.2-LS8.1-RD
  rect 3.03x3.82 hole 0.001: 1(-3.435,0) 2(3.435,0)
SOIC-8_L4.9-W3.9-P1.27-LS6.0-BL
  oval 0.588x1.8 hole 0.001: 1(-1.905,-2.6) 2(-0.635,-2.6) 3(0.635,-2.6) 4(1.905,-2.6) 5(1.905,2.6) 6(0.635,2.6) 7(-0.635,2.6) 8(-1.905,2.6)
SOIC-8_L5.0-W4.0-P1.27-LS6.0-BL-EP2.0
  oval 0.574x2.038 hole 0.001: 1(-1.905,-2.769) 2(-0.635,-2.769) 3(0.635,-2.769) 4(1.905,-2.769) 5(1.905,2.769) 6(0.635,2.769) 7(-0.635,2.769) 8(-1.905,2.769)
  rect 2x2 hole 0.001: 9(0,0)
SOP-8_L5.0-W4.0-P1.27-LS6.0-BL
  oval 0.574x2.035 hole 0.001: 1(-1.905,-2.768) 2(-0.635,-2.768) 3(0.635,-2.768) 4(1.905,-2.768) 5(1.905,2.768) 6(0.635,2.768) 7(-0.635,2.768) 8(-1.905,2.768)
SOT-23-3_L2.9-W1.3-P1.90-LS2.4-BR
  rect 1.25x0.7 hole 0.001: 1(1,-0.95) 2(1,0.95) 3(-1,0)
SOT-23-5_L3.0-W1.7-P0.95-LS2.8-BR
  rect 1x0.6 hole 0.001: 1(1.3,-0.95) 2(1.3,0) 3(1.3,0.95) 4(-1.3,0.95) 5(-1.3,-0.95)
SOT-23-6_L2.9-W1.6-P0.95-LS2.8-BR
  rect 1.1x0.6 hole 0.001: 1(1.35,-0.95) 2(1.35,0) 3(1.35,0.95) 4(-1.35,0.95) 5(-1.35,0) 6(-1.35,-0.95)
SW-SMD_L3.9-W3.0-P4.45
  rect 1.23x1.86 hole 0.001: 1(-2.185,0) 2(2.185,0)
TQFN-16_L3.0-W3.0-P0.50-BL-EP1.7
  rect 0.25x0.75 hole 0.001: 1(-0.749,-1.45) 2(-0.248,-1.45) 3(0.252,-1.45) 4(0.751,-1.45) 9(0.75,1.45) 10(0.25,1.45) 11(-0.25,1.45) 12(-0.749,1.45)
  rect 0.75x0.25 hole 0.001: 5(1.45,-0.75) 6(1.45,-0.25) 7(1.45,0.25) 8(1.45,0.75) 13(-1.45,0.75) 14(-1.45,0.25) 15(-1.45,-0.25) 16(-1.45,-0.75)
  rect 1.7x1.7 hole 0.001: 17(0.001,0)
USB-C-SMD_TYPE-C-6PIN-2MD-073_2
  rect 0.55x1.1 hole 0.001: 1(-3.2,2.375) 2(-2.4,2.375) 11(2.4,2.375) 12(3.2,2.375)
  rect 0.3x1.1 hole 0.001: 3(-1.75,2.375) 4(-1.25,2.375) 5(-0.75,2.375) 6(-0.25,2.375) 7(0.25,2.375) 8(0.75,2.375) 9(1.25,2.375) 10(1.75,2.375)
  oval 1.1x2 hole 0.6x1.5: 13(-4.325,1.825) 14(4.325,1.825)
  oval 1.2x1.8 hole 0.6x1.2: 13(-4.325,-2.375) 14(4.325,-2.375)
WIFIM-SMD_28P-L19.2-W18.0-P1.27-TL_ESPC5-32E-H4
  rect 1.5x0.9 hole 0.001: 1(-8.75,8.25) 2(-8.75,6.98) 3(-8.75,5.71) 4(-8.75,4.44) 5(-8.75,3.17) 6(-8.75,1.9) 7(-8.75,0.63) 8(-8.75,-0.64) 9(-8.75,-1.91) 10(-8.75,-3.18) 11(-8.75,-4.45) 12(-8.75,-5.72) 13(-8.75,-6.99) 14(-8.75,-8.26) 15(8.75,-8.25) 16(8.75,-6.98) 17(8.75,-5.71) 18(8.75,-4.44) 19(8.75,-3.17) 20(8.75,-1.9) 21(8.75,-0.63) 22(8.75,0.64) 23(8.75,1.91) 24(8.75,3.18) 25(8.75,4.45) 26(8.75,5.72) 27(8.75,6.99) 28(8.75,8.26)
  rect 4.5x4.5 hole 0.001: 29(0.8,1.14)
WSON-8_L6.0-W8.0-P1.27-BL-EP
  rect 0.6x1.2 hole 0.001: 1(-1.905,-3.8) 2(-0.635,-3.8) 3(0.635,-3.8) 4(1.905,-3.8) 5(1.905,3.8) 6(0.635,3.8) 7(-0.635,3.8) 8(-1.905,3.8)
  rect 4.3x3.4 hole 0.001: 9(0.001,0.001)

## Nets
As in the schematic.

Pads without a net: LED2 1; SCREW1 1; SCREW2 1; SCREW3 1; SCREW4 1; U1 8 9 20 22 26 27; U2 3 4 9 10 13; U3 10 11 14 15 16; U19 4; USB1 2 3 9 11

## Via types
v1: diameter 0.61, hole 0.305, Top Layer to Bottom Layer, 160 vias

## Routing (per net, layer and track width the routed paths; a pad name or vN(x,y) marks a point on that pad's centre or on a via; arc(x,y) is an arc through that point)
24V: length 7.1
  Top Layer w0.254: 14.73,8.82 12.39,11.16 U7.7
  Top Layer w0.762: A3.1 14.73,6.35 R44.2
+5V: length 200.6
  Top Layer w0.254: U3.9 v1(40.68,47.19) C16.2 ; U19.1 34.73,33.27 34.42,33.58 34.42,34.85 34.73,35.17 U19.3 ; v1(20.31,48.66) 20.32,48.67 v1(20.32,50.73) 21.34,50.73 22.25,51.64 U14.8 ; v1(8,56.19) 8.25,55.94 U2.15 ; R29.1 30.73,52.76 ; U3.3 41.17,54.19 v1(40.89,54.47) ; L2.2 45.05,30.33 v1(45.42,29.96) ; v1(29.06,39.04) 28.96,39.14 U5.6 ; U6.1 38.07,60.79 39.24,59.62 45.21,59.62 46.61,58.22 46.61,38.41 41.91,33.71 D6.1 ; U4.6 22.29,40.75 v1(22.29,39.04) ; C5.2 45.86,29.88 46.89,28.85 arc(47.06,28.61) 47.12,28.31 47.12,26.76 arc(47.06,26.47) 46.89,26.22 R21.2
  Inner2 w0.254: v1(34.29,30.92) 28.07,30.92 27.43,31.55 27.43,34.98 29.06,36.61 v1(29.06,39.04) ; v1(8,56.19) 5.99,54.18 v1(5.99,53.82) 5.99,48.67 7.37,47.3 15.37,47.3 15.66,47.59 15.66,48.48 15.88,48.7 20.28,48.7 v1(20.31,48.66) 22.16,48.66 ; 22.16,48.66 39.21,48.66 v1(40.68,47.19) ; 22.16,48.66 22.16,50.29 21.72,50.73 v1(20.32,50.73) ; v1(41.4,33.71) 40.39,34.73 40.39,41.46 40.68,41.75 v1(40.68,47.19) ; v1(40.68,47.19) 40.68,54.25 v1(40.89,54.47) 39.94,55.43 34.8,55.43 32.13,52.76 v1(30.73,52.76) ; v1(37.21,32.19) 37.21,30.15 36.96,29.9 23.24,29.9 22.29,30.85 v1(22.29,39.04)
  vias: v1(41.4,32.44) v1(41.4,31.17) v1(41.4,29.9) v1(43.39,29.99)
GND:
  vias: v1(1.61,59.12) v1(2.41,18.03) v1(2.42,17.07) v1(6.42,35.8) v1(6.42,34.93) v1(6.42,34.14) v1(6.42,33.32) v1(6.42,32.51) v1(7.35,36.76) v1(7.33,35.8) v1(7.33,34.93) v1(7.33,34.14) v1(7.33,33.32) v1(7.33,32.51) v1(8.23,35.8) v1(8.23,34.93) v1(8.23,34.14) v1(8.23,33.32) v1(8.23,32.51) v1(8.25,36.76) v1(8.44,14.15) v1(9.14,35.8) v1(9.14,34.93) v1(9.14,34.14) v1(9.14,33.32) v1(9.14,32.51) v1(9.12,19.3) v1(9.16,36.76) v1(10.05,35.8) v1(10.05,34.93) v1(10.05,34.14) v1(10.05,33.32) v1(10.05,32.51) v1(10.07,36.76) v1(11.74,9.89) v1(11.75,56.19) v1(18.74,56.06) v1(20.45,20.25) v1(20.45,19.36) v1(20.45,18.47) v1(24.72,41.97) v1(26.06,52.48) v1(29.19,34.8) v1(29.52,56.06) v1(30.46,39.04) v1(31.16,34.8) v1(31.66,41.97) v1(32.26,9.96) v1(32.7,2.19) v1(32.7,0.96) v1(33.85,39.04) v1(35.12,2.19) v1(35.12,0.99) v1(35.38,34.22) v1(36.82,62.49) v1(37.53,2.19) v1(37.59,0.94) v1(39.18,15.41) v1(39.28,14.41) v1(39.94,2.19) v1(40,0.94) v1(40.26,17.68) v1(41.15,26.34) v1(41.15,24.88) v1(41.43,50.62) v1(41.36,27.88) v1(42.64,15.51) v1(42.64,14.41) v1(43.18,26.34) v1(43.31,24.88) v1(43.39,27.81) v1(43.61,15.51) v1(43.6,14.41) v1(43.95,13.25) v1(44.55,15.51) v1(44.46,14.41) v1(44.83,26.34) v1(45.42,27.88) v1(45.47,15.06) v1(45.47,13.25) v1(45.92,33.71) v1(46.99,15.04) v1(46.99,13.25)
VIN: length 132.2
  Top Layer w0.508: R16.2 40.26,9.82 U9.2
  Top Layer w0.762: D1.2 13.81,1.73 A3.2 15.16,1.2 23.75,1.2 27.92,5.37 C3.2 C2.2 C1.2 C45.2 39.77,5.55 R16.2 ; v1(17.62,5.97) v1(18.88,5.97) v1(19.95,5.97) v1(20.92,5.97) v1(22,5.97) v1(23.04,5.97) 25.65,3.36
  Bottom Layer w0.762: v1(23.04,5.97) v1(22,5.97) v1(20.92,5.97) v1(19.95,5.97) v1(18.88,5.97) v1(17.62,5.97)
  Bottom Layer w1.143: v1(17.62,5.97) 17.11,5.46 9.83,5.46 9.14,6.15 9.14,10.72 8,11.87 6.35,11.87 5.08,13.14 5.08,36.89 6.17,37.97 12.95,37.97 13.84,38.86 13.84,57.59 14.48,58.22 18.03,58.22 18.16,58.34 18.16,60.38 CN1.4
2812DI: length 17.3
  Top Layer w0.254: v1(1.27,47.93) 1.27,49.02 LED2.3
  Bottom Layer w0.254: v1(1.27,47.93) 1.27,43.36 1.75,42.88 v1(12.57,42.88)
A: length 12.9
  Top Layer w0.254: U23.1 25.33,59.94 CN1.2 ; U23.1 25.33,55.38 R29.2 ; U23.1 24.79,55.52 U14.6
B: length 13
  Top Layer w0.254: U22.1 22.92,55.31 R28.1 ; U22.1 23.52,55.46 U14.7 ; U22.1 22.92,59.68 CN1.3
BOOT: length 22
  Top Layer w0.254: v1(19.43,42.88) U1.15
  Inner2 w0.254: v1(19.43,42.88) 38.38,42.88 v1(39.24,43.74)
D+: length 31.2
  Top Layer w0.254: v1(15.51,52.34) 15.51,55.67 15.24,55.94 13.21,55.94 U2.6 ; v1(33.92,50.51) 34.48,50.51 34.67,50.32 39.3,50.32 39.35,50.37 U3.7
  Bottom Layer w0.254: v1(15.51,52.34) 16.07,52.34 16.26,52.15 20.87,52.15 22.7,50.32 33.17,50.32 33.36,50.51 v1(33.92,50.51)
D-: length 31.2
  Top Layer w0.254: U3.8 39.35,49.87 39.3,49.92 34.67,49.92 34.48,49.72 v1(33.92,49.72) ; U2.5 13.22,55.43 14.35,55.43 14.92,54.86 14.92,51.74 15.11,51.55 v1(15.51,51.55)
  Bottom Layer w0.254: v1(33.92,49.72) 33.36,49.72 33.17,49.92 22.53,49.92 20.7,51.74 16.26,51.74 16.07,51.55 v1(15.51,51.55)
DE/RE: length 43.1
  Top Layer w0.254: R8.1 27.82,48.82 25.4,48.82 24.79,48.22 U14.3 U14.2 ; v1(19.18,36.89) 13.72,36.89 12.57,35.74 12.57,33.96 12.58,33.96 U1.10
  Bottom Layer w0.254: v1(19.18,36.89) 26.92,36.89 27.94,37.9 27.94,43.11 24.76,46.28 v1(24.76,47.05)
DI: length 6.2
  Top Layer w0.254: U5.4 28.9,42.92 27.95,43.86 R32.1 27.67,46.94 U14.4
DIX: length 46.9
  Top Layer w0.254: v1(29.46,46.66) 34.54,46.66 35.18,46.03 35.18,41.58 34.67,41.08 ; 34.67,41.08 33.8,41.08 R11.1 ; 34.67,41.08 35.81,39.93 35.81,37.65 35.05,36.89 28.32,36.89 26.03,34.6 15.49,34.6 15.12,34.22 U1.12
DTR: length 13.3
  Top Layer w0.254: 43.44,45.9 43.31,46.04 43.31,48.04 U3.12 ; 43.44,45.9 43.81,45.9 44.2,45.52 44.2,41.2 43.68,40.69 R1.2 ; 43.44,45.9 42.54,45.9 41.33,44.69 Q2.2
EN: length 49.6
  Inner2 w0.254: v1(3.69,25.38) 3.69,26.86 4.06,27.23 38.61,27.23 39.37,28 v1(39.37,39.93)
ESPC5_3V3: length 53.9
  Top Layer w0.254: v1(42.93,54.47) 42.17,53.72 U3.1 ; U10.3 15.19,19.94 v1(15.31,20.06) 15.35,20.03 R55.2 ; v1(29.19,33.4) 29.33,33.27 v1(32.78,33.27) ; U7.5 10.36,8.62 9.84,9.13 v1(9.84,14.15) 9.84,15.23 9.02,16.06 5.97,16.06 5.22,16.81 U10.8 U10.7 ; U4.1 24.72,40 v1(25.67,39.04) ; U3.6 37.2,50.87 36.96,51.11 36.96,54.03 37.4,54.47 v1(38.86,54.47) ; U1.2 2.42,20.31 2.54,20.31 ; R6.1 R7.1 R9.1 R10.1 ; v1(4.57,48.7) 4.17,49.1 LED2.4 ; v1(32.45,39.04) 32.45,40.23 U5.1 30.79,41.02 29.84,41.97 U5.5
  vias: v1(1.91,20.95) v1(1.91,19.99) v1(2.81,12.84) v1(2.93,20.95) v1(2.92,19.99) v1(24.63,20.25) v1(31.16,33.4)
FB: length 4.7
  Top Layer w0.254: U9.5 44.84,17.68 RLS.2 RHS.1
FLASH_CS: length 18.7
  Top Layer w0.254: U1.6 7.62,25.25 v1(7.62,23.04) ; R55.1 14.85,17.4 U10.1
  Bottom Layer w0.254: v1(15.37,16.82) 8.38,16.82 7.62,17.58 v1(7.62,23.04)
FLASH_MISO: length 9.4
  Top Layer w0.254: U10.2 12.37,18.67 11.43,19.61 11.43,22.53 10.79,23.17 9.53,23.17 8.77,23.93 U1.7
FLASH_MOSI: length 4.6
  Top Layer w0.254: U1.5 6.23,22.22 U10.5
FLASH_SCK: length 6.4
  Top Layer w0.254: U10.6 4.95,19.94 4.06,20.83 4.06,22.53 4.96,23.43 U1.4
IO4: length 54.7
  Top Layer w0.254: v1(6.54,9.89) 4.46,9.89 R7.2 ; v1(0.76,37.9) 4.19,37.9 4.57,38.28 4.57,41.08 4.95,41.46 14.86,41.46 15.11,41.71 U1.17
  Bottom Layer w0.254: v1(0.76,37.9) 0.51,37.65 0.51,10.6 1.14,9.96 6.46,9.96 v1(6.54,9.89)
IO5: length 57.5
  Top Layer w0.254: v1(1.65,37.14) 4.19,37.14 5.08,38.03 5.08,40.57 5.33,40.82 16,40.82 16.38,41.2 U1.16 ; R6.2 6.19,8.27 v1(6.54,8.62)
  Bottom Layer w0.254: v1(6.54,8.62) 7.17,8.62 7.55,9 7.55,10.54 7.37,10.72 1.65,10.72 1.02,11.36 1.02,36.5 v1(1.65,37.14)
IO9: length 38
  Top Layer w0.254: v1(18.86,46.66) 18.86,45.96 20.45,44.38 20.45,36.12 19.94,35.61 14.86,35.61 13.85,34.6 U1.11
  Bottom Layer w0.254: v1(18.86,46.66) 21.23,46.66 v1(26.84,41.06)
IO23: length 60.1
  Top Layer w0.254: v1(34.29,63.43) 34.29,62.52 U6.4 ; v1(10.03,44.63) U1.21
  Bottom Layer w0.254: v1(34.29,63.43) 33.91,63.81 5.21,63.81 2.41,61.02 2.41,44.76 2.92,44.25 9.65,44.25 v1(10.03,44.63)
IO24: length 56.5
  Top Layer w0.254: U1.23 7.49,42.88 v1(7.49,45.14)
  Bottom Layer w0.254: v1(7.49,45.14) 3.43,45.14 2.79,45.78 2.79,60.89 5.33,63.43 32.13,63.43 33.02,62.54 35.56,62.54
  vias: v1(35.57,62.49)
IO27: length 36.5
  Top Layer w0.254: U1.18 13.84,43.99 v1(15.24,45.39) ; v1(14.48,23.17) 14.62,23.03 22.01,23.03 23.12,21.91 R3.1
  Bottom Layer w0.254: v1(14.48,23.17) 14.48,34.47 15.24,35.23 v1(15.24,45.39)
OTG_FS_DM: length 5.5
  Top Layer w0.254: USB1.7 10.54,61.12 10.82,61.4 11.28,61.4 11.54,61.13 USB1.5 11.54,59.61 11.5,59.57 11.5,59.14 11.46,59.1 11.46,58.28 11.5,58.23 U2.11
OTG_FS_DP: length 5.4
  Top Layer w0.254: 11.05,58.82 11.05,58.28 11,58.23 U2.12 ; 11.05,58.82 10.07,58.82 10.03,58.86 10.03,60.41 USB1.8 ; 11.05,58.82 11.05,59.27 11.09,59.31 11.09,59.57 11.04,59.61 USB1.6
RO: length 6.1
  Top Layer w0.254: U4.4 22.25,43.15 U14.1 21.97,46.66 R31.1
RTS: length 13.7
  Top Layer w0.254: U3.13 44.42,49.87 45.09,49.2 v1(45.09,44.38)
  Bottom Layer w0.254: v1(45.09,44.38) v1(42.8,44.38) 41.26,42.84 v1(41.26,40.88)
RX0: length 66.1
  Top Layer w0.254: U3.4 39.55,52.07 39.37,52.25 v1(39.37,53.01) ; v1(6.35,46.03) 6.35,43.01 U1.24
  Bottom Layer w0.254: v1(6.35,46.03) 3.56,46.03 3.17,46.41 3.17,60.76 5.46,63.05 31.88,63.05 39.75,55.17 39.75,53.39 v1(39.37,53.01)
TX0: length 63.7
  Top Layer w0.254: U3.5 38.35,51.37 38.1,51.62 v1(38.1,52.12) ; U1.25 5.08,43.01 v1(5.08,47.05)
  Bottom Layer w0.254: v1(38.1,52.12) 38.1,56.19 31.75,62.54 5.46,62.54 3.56,60.63 3.56,47.3 3.81,47.05 v1(5.08,47.05)
USB_D+: length 35.7
  Top Layer w0.254: v1(17.54,50.21) 17.54,50.77 17.35,50.96 17.35,56.23 16.65,56.94 U2.8 ; U1.14 17.66,26.38 17.23,26.81 17.23,29.79 17.42,29.98 v1(17.42,30.53)
  Bottom Layer w0.254: v1(17.42,30.53) 17.42,31.09 17.35,31.16 17.35,49.46 17.54,49.65 v1(17.54,50.21)
USB_D-: length 35.7
  Top Layer w0.254: U2.7 16.51,56.44 16.95,56.01 16.95,54.52 16.69,54.26 16.69,54.01 16.95,53.76 16.95,53.5 16.69,53.25 16.69,52.99 16.95,52.74 16.95,52.49 16.69,52.23 16.69,51.98 16.95,51.72 16.95,50.96 16.76,50.77 v1(16.76,50.21) ; U1.13 16.39,26.38 16.82,26.81 16.82,29.79 16.63,29.98 v1(16.63,30.53)
  Bottom Layer w0.254: v1(16.63,30.53) 16.63,31.09 16.95,31.41 16.95,49.46 16.76,49.65 v1(16.76,50.21)
XTVIN: length 17.7
  Top Layer w0.254: U7.8 14,12.43 R44.1
  Top Layer w0.762: R44.1 18.59,15.55 24.01,15.55 CN6.2
$1N2: length 4.7
  Top Layer w0.254: R16.1 41.53,9.56 U9.3
  Top Layer w0.762: R16.1 R17.2
$1N4: length 3
  Top Layer w0.254: R18.2 43.7,11.25 U9.4
$1N11: length 5.3
  Top Layer w0.254: C11.2 41.53,22.42 U9.6
$1N13: length 2.5
  Top Layer w0.254: C13.2 43.2,22.7 R19.1
$1N17: length 2.9
  Top Layer w0.254: U9.1 38.73,12.14 C41.1
$1N21: length 1.9
  Top Layer w0.762: POWER1.2 17.62,9.82 R14.1
$1N24: length 1.9
  Top Layer w0.254: RHS.2 45.41,20.92 R21.1
$1N35: length 1.6
  Top Layer w0.254: R1.1 42.6,38.98 Q1.1
$1N36: length 1.5
  Top Layer w0.254: R2.1 42.7,42.77 Q2.1
$1N60: length 3.9
  Top Layer w0.254: X1.3 11.75,51.12 C26.1 11.5,53.16 U2.2
$1N61: length 6.8
  Top Layer w0.254: X1.1 9.84,49.27 10.79,50.22 10.79,52.09 C25.1 9.97,52.95 11,53.99 U2.1
$1N64: length 9.8
  Top Layer w0.254: U2.16 7.34,55.44 ; 7.34,55.44 6.24,55.44 6.14,55.54 ; 7.34,55.44 7.34,53.44 C8.1 C9.1
$1N65: length 1.6
  Top Layer w0.254: R5.2 4.54,57.16 LED1.1
$1N66: length 4.6
  Top Layer w0.254: U2.14 8.89,56.44 8.17,57.16 R5.1
$2N19: length 2
  Top Layer w0.254: R30.1 R8.2
$2N64: length 2.3
  Top Layer w0.254: U5.3 33.47,42.92 R11.2
$2N65: length 2.2
  Top Layer w0.254: U4.3 26.53,42.92 R12.2
$2N83: length 7.3
  Top Layer w0.254: USB1.10 9.04,59.14 8.89,58.98 3.26,58.98 3.12,59.12
$2N90: length 11.8
  Top Layer w0.254: 3.12,60.86 3.4,60.86 5.21,62.67 11.81,62.67 12.04,62.43 USB1.4
$2N111: length 2.2
  Top Layer w0.254: R9.2 6.38,11.32 U7.2
$2N112: length 2.3
  Top Layer w0.254: R10.2 6.12,12.84 U7.1

## Copper pours and planes (outline as drawn; the poured copper is in the pictures)
+5V on Top Layer: 32.38,28.76 32.26,28.63 32.13,28.76 32.13,31.93 32.51,32.31 34.42,32.31 34.65,32.54 34.65,33.4 34.96,33.71 36.19,33.71 36.45,33.96 39.88,33.96 40,34.09 40,34.73 40.51,35.23 41.91,35.23 42.67,34.47 42.67,31.68 43.05,31.3 46.23,31.3 46.35,31.17 46.35,29.14 46.1,28.88 40.26,28.88 40.13,28.76
GND on Top Layer: -5.59,71.17 51.69,71.17 51.69,-4.26 -5.59,-4.26
GND on Bottom Layer: -8.64,71.94 51.56,71.94 51.56,-4.26 -8.64,-4.26
GND on Inner1: -6.48,71.56 53.09,71.56 53.09,-4.01 -6.48,-4.01
ESPC5_3V3 on Inner2: -4.95,72.95 62.48,72.95 62.48,-6.17 -4.95,-6.17
$1N12 on Top Layer: 29.21,15.04 28.83,15.42 28.83,22.03 29.34,22.53 38.86,22.53 39.5,21.9 39.5,16.68 39.25,16.44 38.22,16.44 38.1,16.31 38.1,15.17 37.97,15.04

Small or netless copper shapes (teardrops, artwork), in the pictures only: 255 on Top Layer, 35 on Bottom Layer, 22 on Inner2

## Text on the board
Bottom Silkscreen Layer: OTG | 485B | 485A | DNG | 24v
Top Silkscreen Layer: 23 | 24 | GND | 5V | FLASH | - | + | KEY | S
